# EasyEDA Pro project sataswitch.eprj

# Schematic Schematic1

## Sheets
1 ESP-12F: Board Name: Board1; Create Date: 2024-12-13; Page Name: ESP-12F; Project Name: sataswitch; Schematic Name: Schematic1; Update Date: 2024-12-13; Company: 嘉立创EDA; Page Size: A4; Version: V1.0
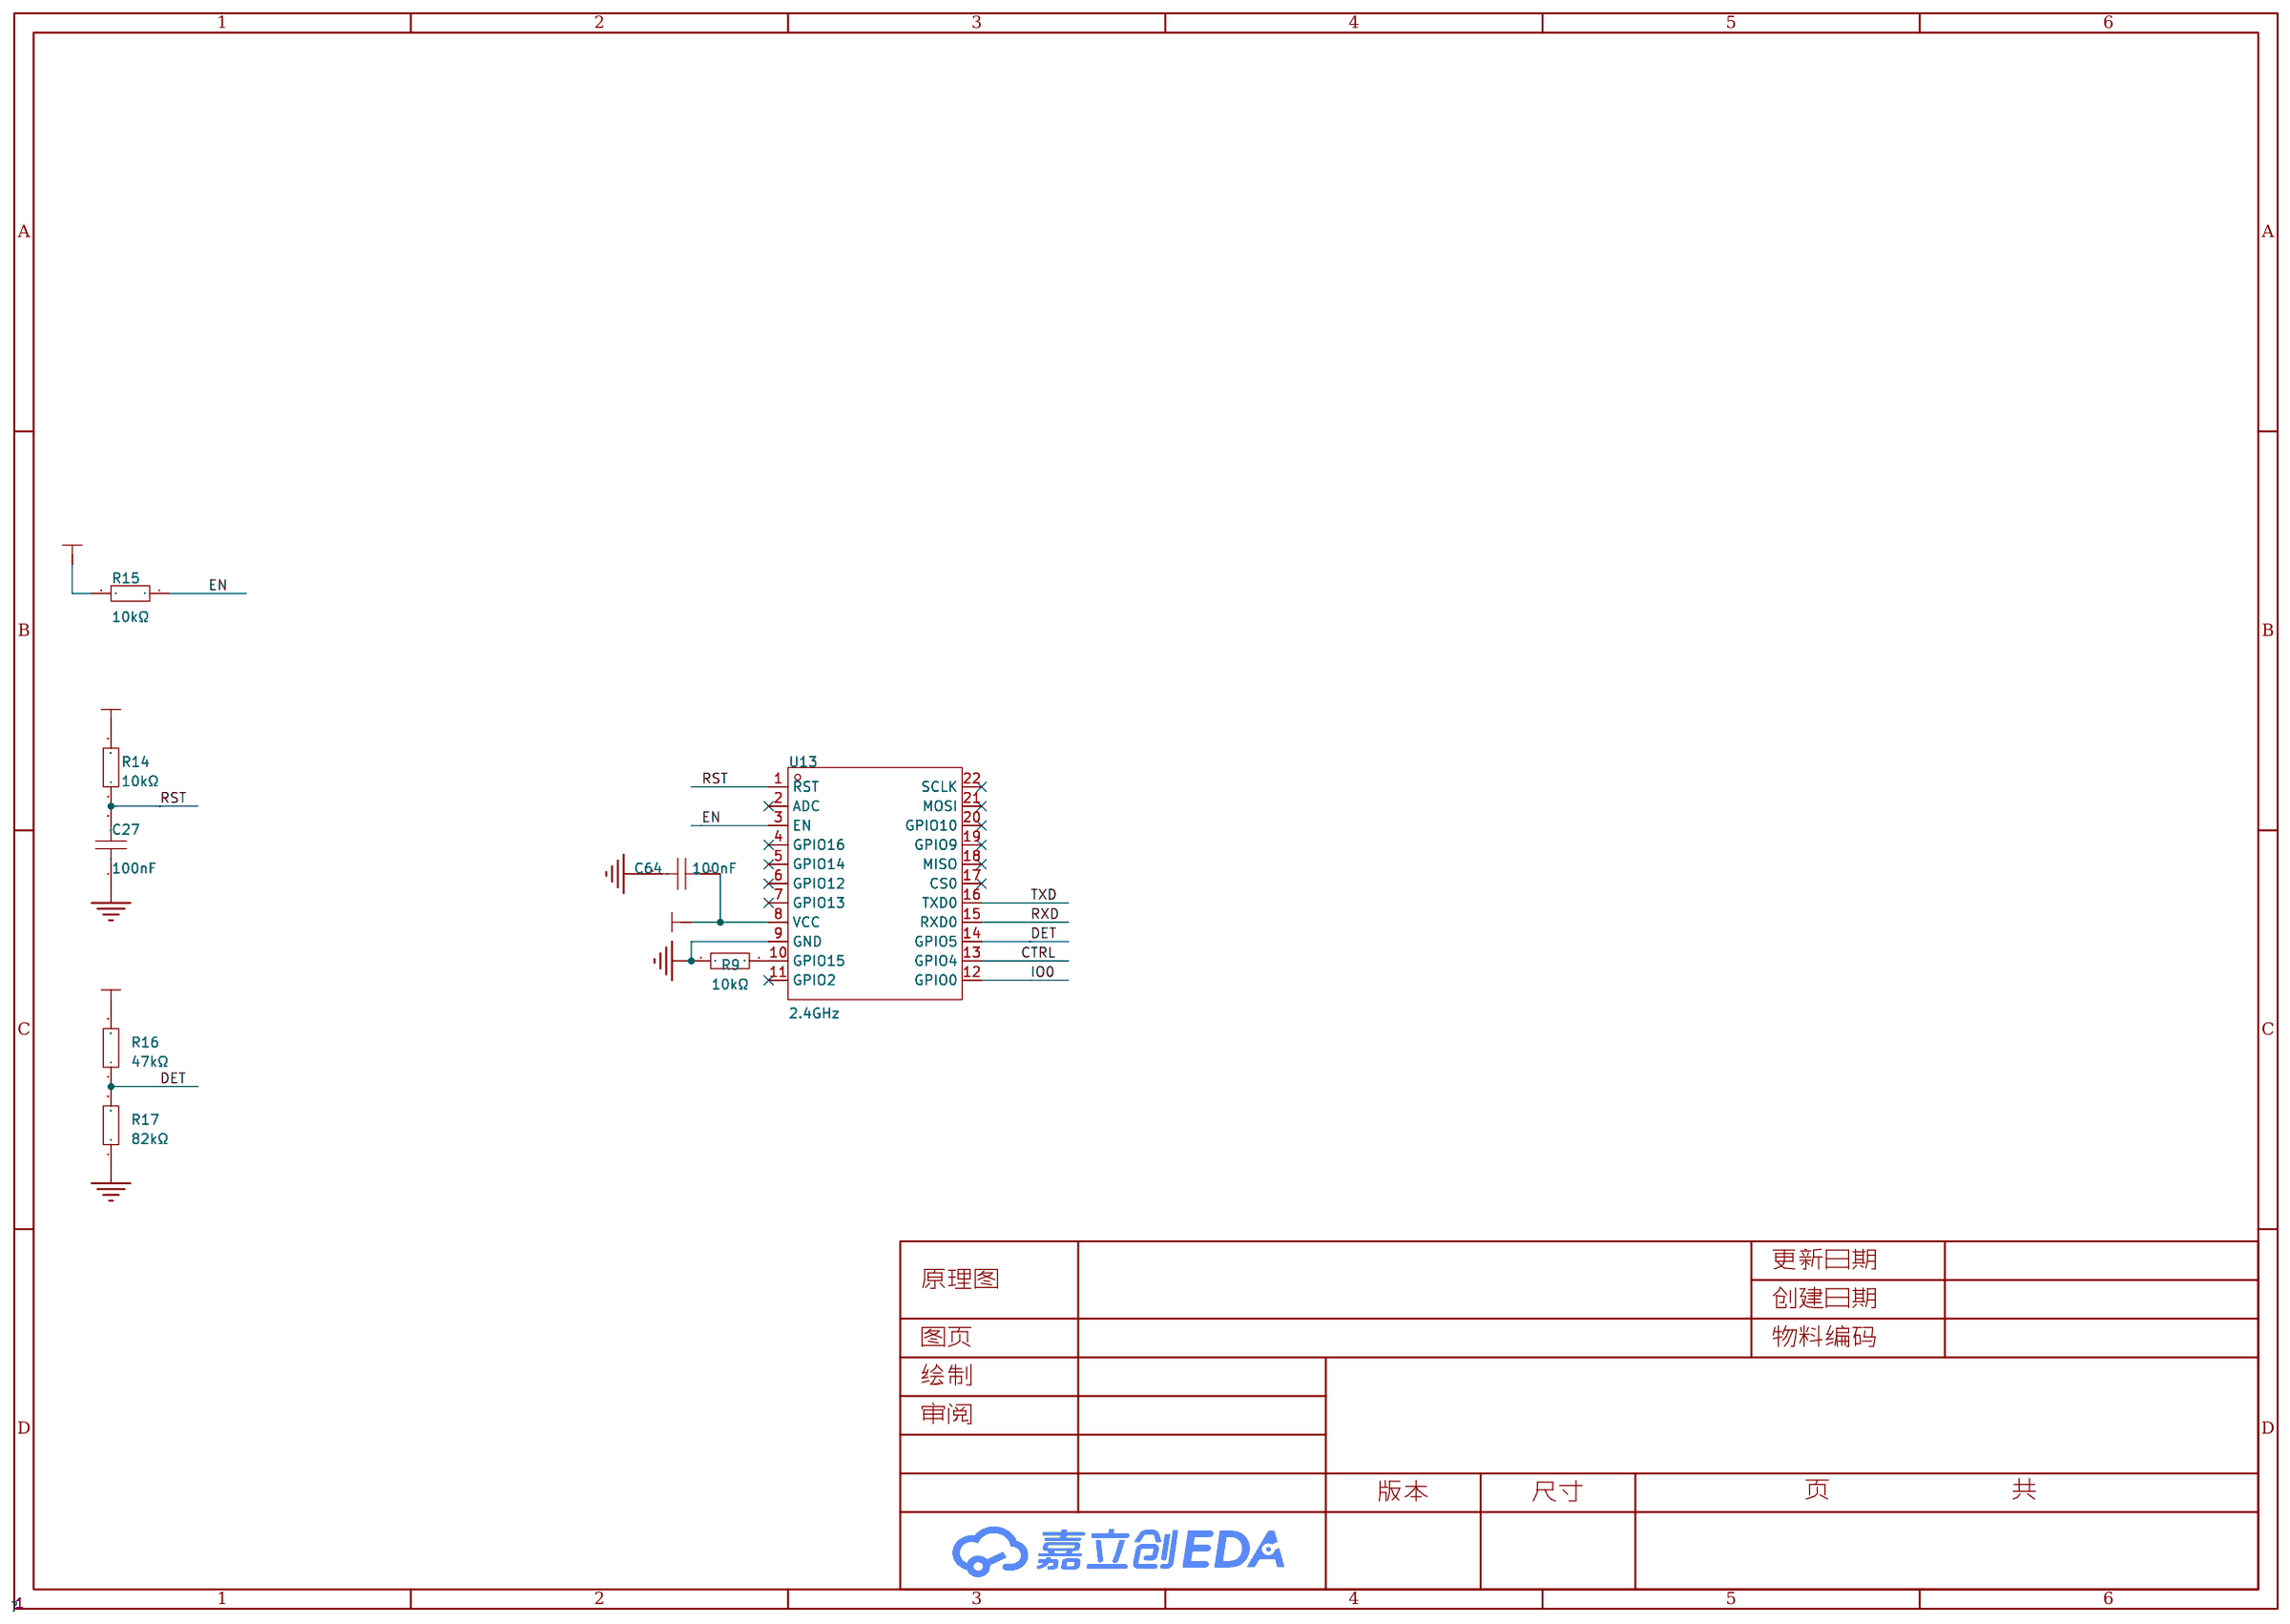
[diagram p0: ESP-12F]
2 CH340K自动下载: Page Name: CH340K自动下载
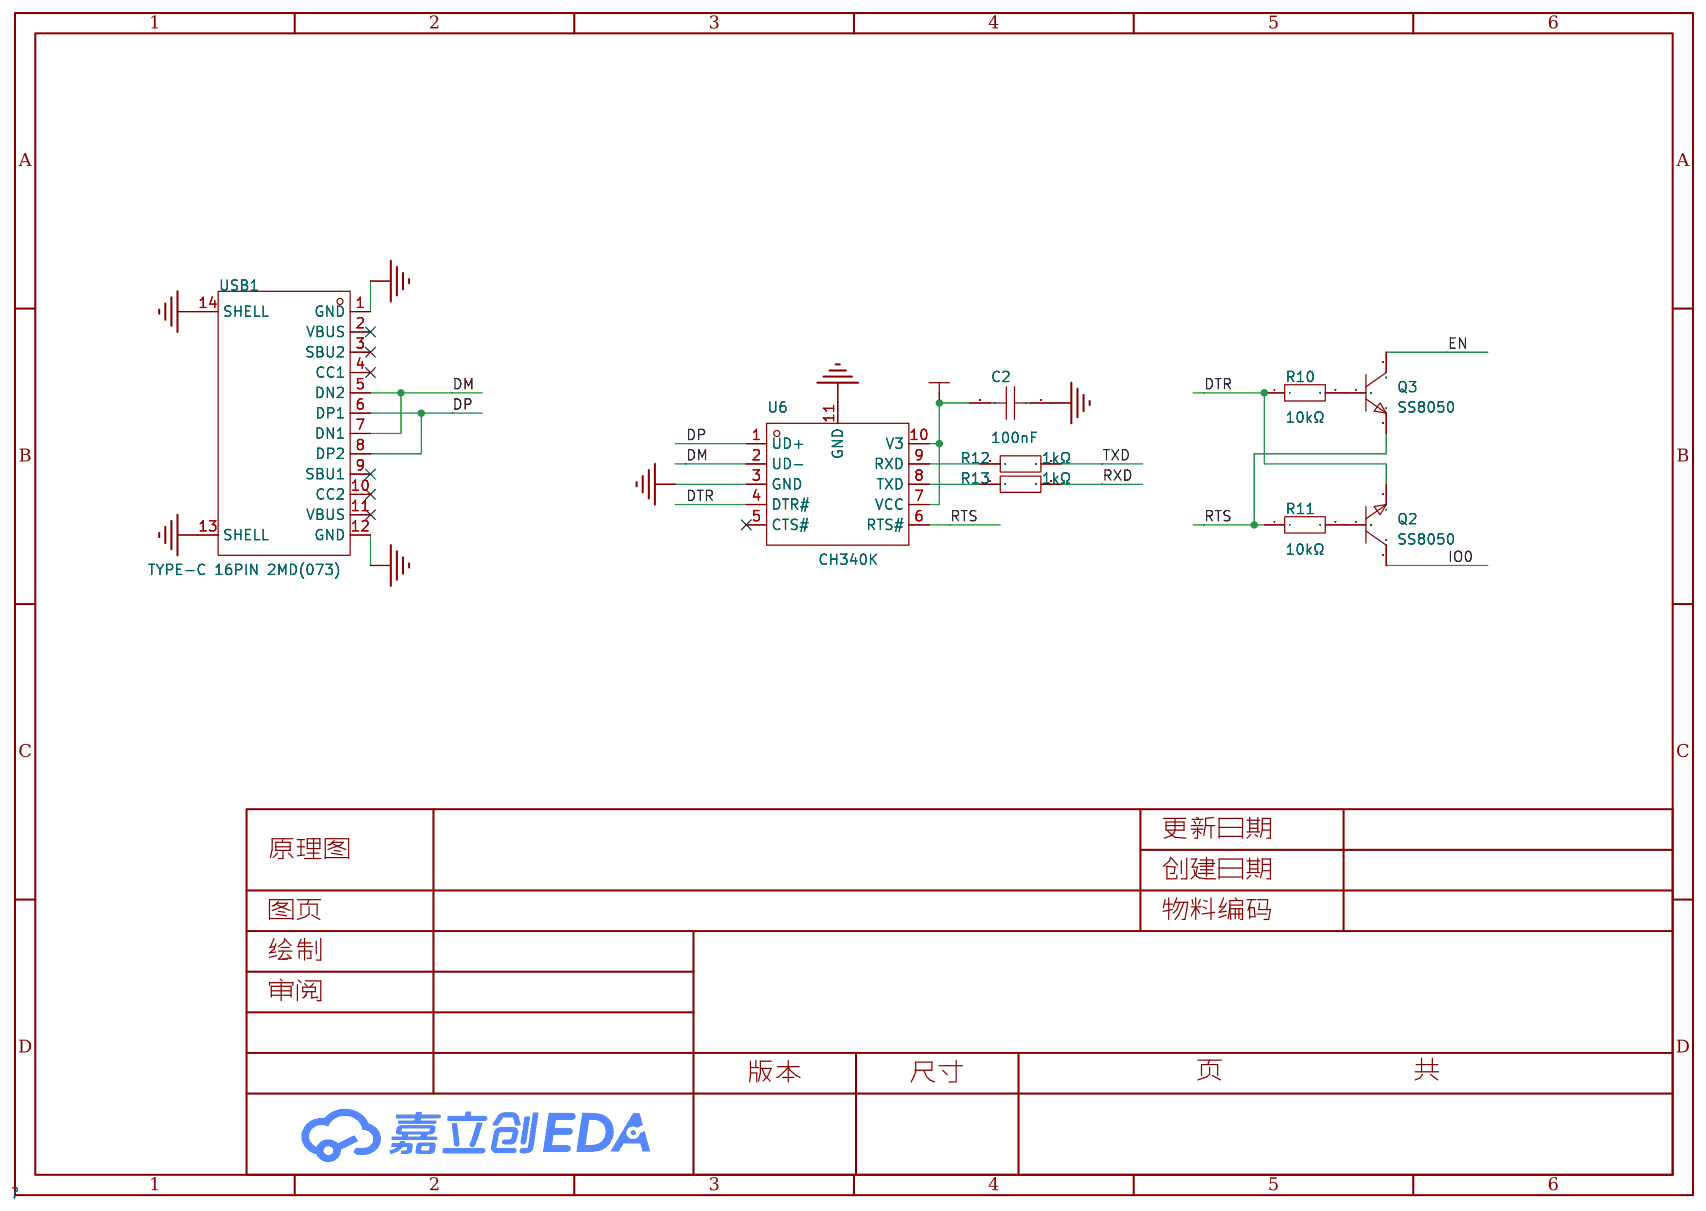
[diagram p1: CH340K自动下载]
3 POWER: Page Name: POWER
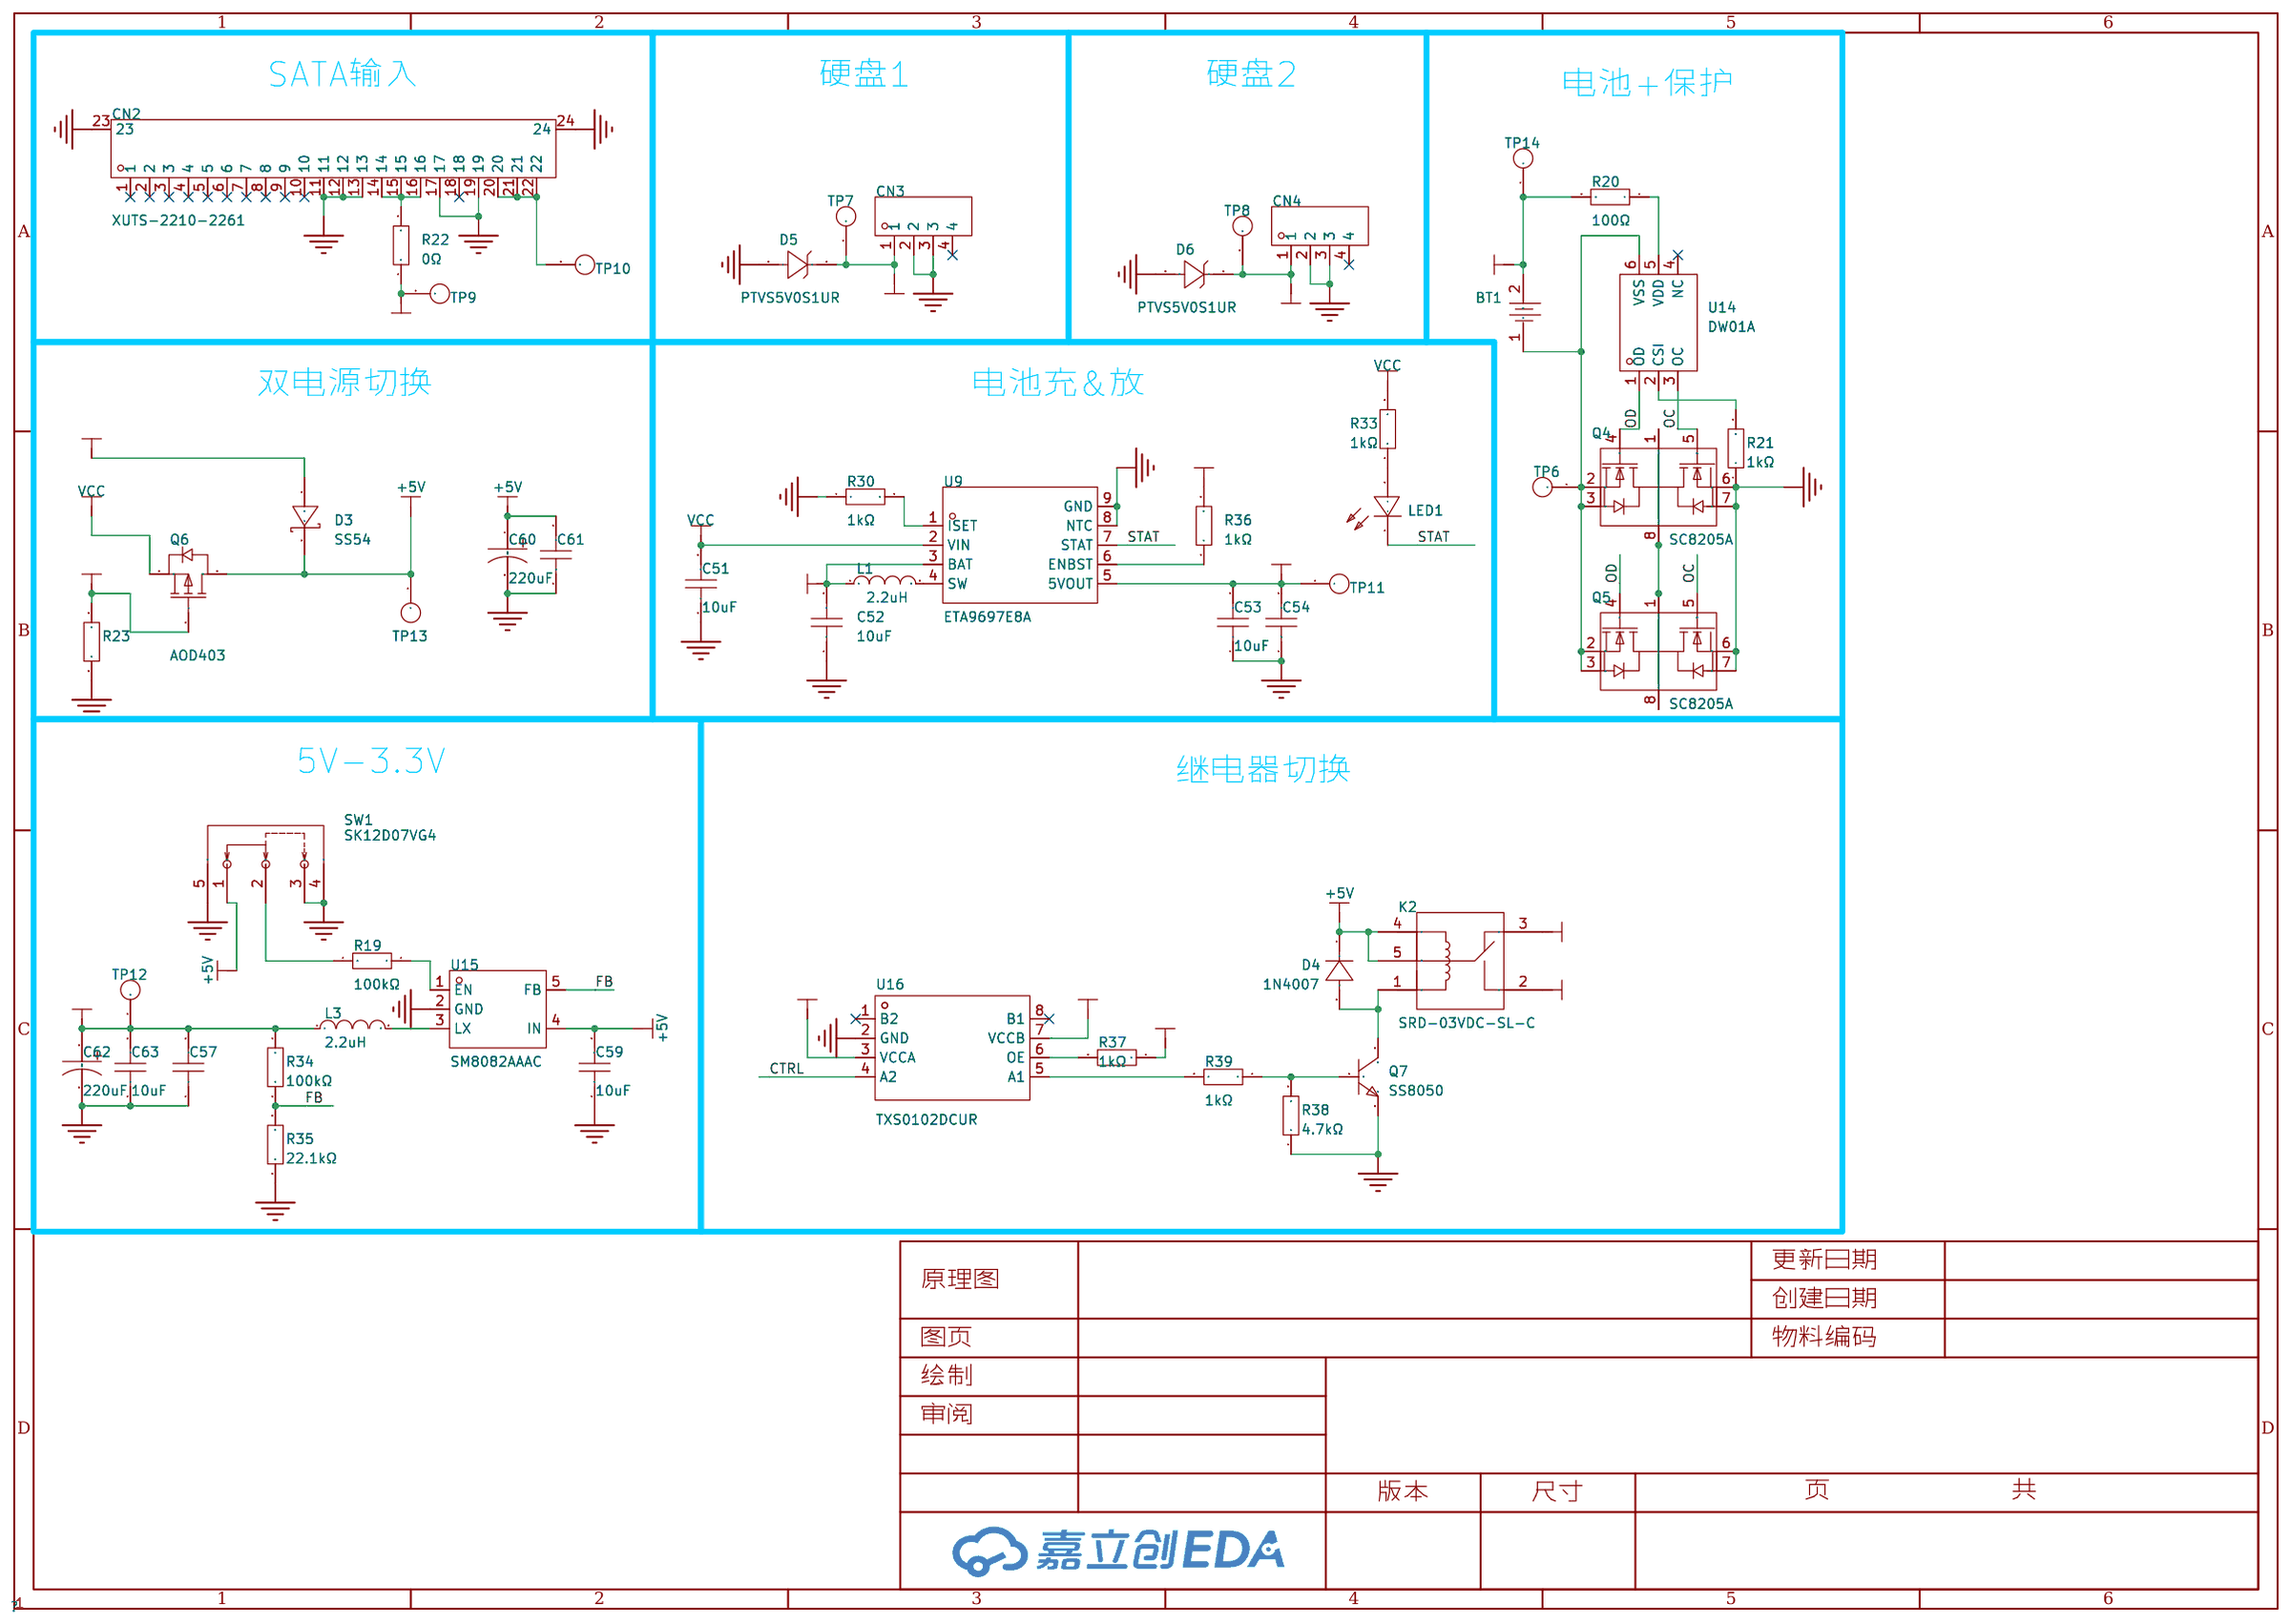
[diagram p2: POWER]

## Parts
sheet CH340K自动下载
C2  100nF  [C0603]
Q2  SS8050  [SOT-23-3_L2.9-W1.6-P1.90-LS2.8-BR]
Q3  SS8050  [SOT-23-3_L2.9-W1.6-P1.90-LS2.8-BR]
R10  10kΩ  [R0603]
R11  10kΩ  [R0603]
R12  1kΩ  [R0603]
R13  1kΩ  [R0603]
U6  CH340K  [ESOP-10_L4.9-W3.9-P1.00-LS6.0-BL-EP]
USB1  TYPE-C 16PIN 2MD(073)  [USB-C-SMD_TYPE-C-6PIN-2MD-073]
sheet ESP-12F
C27  100nF  [C0603]
C64  100nF  [C0603]
R9  10kΩ  [R0603]
R14  10kΩ  [R0603]
R15  10kΩ  [R0603]
R16  47kΩ  [R0603]
R17  82kΩ  [R0603]
U13  2.4GHz  [WIFIM-SMD_ESP-12F-ESP8266MOD]
sheet POWER
BT1  BH-18650-B1BA002  [BATTERY-SMD_18650-1S-L77.1-W20.7-1]
C51  10uF  [C0603]
C52  10uF  [C0603]
C53  10uF  [C0603]
C54  100nF  [C0603]
C57  100nF  [C0603]
C59  10uF  [C0603]
C60  220uF  [CAP-SMD_BD6.3-L6.6-W6.6-LS7.2-FD]
C61  100nF  [C0603]
C62  220uF  [CAP-SMD_BD6.3-L6.6-W6.6-LS7.2-FD]
C63  10uF  [C0603]
CN2  XUTS-2210-2261  [CONN-SMD_XUTS-2210-2261]
CN3  WAFER-PH2.0-4PZZ  [CONN-TH_4P-P2.00_FWF20001-S04S22W5B]
CN4  WAFER-PH2.0-4PZZ  [CONN-TH_4P-P2.00_FWF20001-S04S22W5B]
D3  SS54  [SMA_L4.4-W2.8-LS5.4-R-RD]
D4  1N4007  [SMA_L4.3-W2.5-LS5.0-RD]
D5  PTVS5V0S1UR  [SOD-123FL_L2.7-W1.8-LS3.8-RD]
D6  PTVS5V0S1UR  [SOD-123FL_L2.7-W1.8-LS3.8-RD]
K2  SRD-03VDC-SL-C  [RELAY-TH_SRD-03VDC-SL-C]
L1  2.2uH  [IND-SMD_L4.6-W4.1]
L3  2.2uH  [IND-SMD_L3.0-W3.0]
LED1  MHT192UGCT  [LED0603-RD_GREEN]
Q4  SC8205A  [TSSOP-8_L4.4-W3.0-P0.65-LS6.4-BL]
Q5  SC8205A  [TSSOP-8_L4.4-W3.0-P0.65-LS6.4-BL]
Q6  AOD403  [TO-252-3_L6.5-W5.8-P4.58-TL]
Q7  SS8050  [SOT-23-3_L2.9-W1.6-P1.90-LS2.8-BR]
R19  100kΩ  [R0603]
R20  100Ω  [R0603]
R21  1kΩ  [R0603]
R22  0Ω  [R2512]
R23  10kΩ  [R0603]
R30  1kΩ  [R0603]
R33  1kΩ  [R0603]
R34  100kΩ  [R0603]
R35  22.1kΩ  [R0603]
R36  1kΩ  [R0603]
R37  1kΩ  [R0603]
R38  4.7kΩ  [R0603]
R39  1kΩ  [R0603]
SW1  SK12D07VG4  [SW-TH_SK12D07VG4]
TP6  -  [测试点]
TP7  -  [测试点]
TP8  -  [测试点]
TP9  -  [测试点]
TP10  -  [测试点]
TP11  -  [测试点]
TP12  -  [测试点]
TP13  -  [测试点]
TP14  -  [测试点]
U9  ETA9697E8A  [ESOP-8_L4.9-W3.9-P1.27-LS6.0-BL-EP]
U14  DW01A  [SOT-23-6_L2.9-W1.6-P0.95-LS2.8-BL]
U15  SM8082AAAC  [SOT-23-5_L3.0-W1.7-P0.95-LS2.8-BL]
U16  TXS0102DCUR  [VSON8_L2.0-W2.3-P0.50-LS3.1-BL]

## Library data of the parts
C2 C27 C54 C57 C61 C64 = CC0603KRX7R9BB104: 容值:100nF;精度:±10%;额定电压:50V;材质(温度系数):X7R;; LCSC Part Name: 100nF ±10% 50V; Supplier Part: C14663; Manufacturer: YAGEO(国巨); Supplier Footprint: 0603; JLCPCB Part Class: 基础库; Datasheet: https://atta.szlcsc.com/upload/public/pdf/source/20180910/C282072_33301C7F631E79921B82A8DAC6BCC5B3.pdf; Supplier: LCSC; Tolerance: ±10%; Voltage Rated: 50V; Temperature Coefficient: X7R
Q2 Q3 Q7 = SS8050_C181160: 晶体管类型:NPN;集电极电流(Ic):1.5A;集射极击穿电压(Vceo):25V;功率(Pd):300mW;直流电流增益(hFE@Ic,Vce):200@100mA,1V;; LCSC Part Name: NPN 电流:1.5A 耐压:25V H档（200-350）; Supplier Part: C181160; Manufacturer: Hottech(合科泰); Supplier Footprint: SOT-23; JLCPCB Part Class: 扩展库; Datasheet: https://atta.szlcsc.com/upload/public/pdf/source/20220506/87BBA77FEE9CB4B19031AE933C67329E.pdf; Supplier: LCSC; Transistor Type: NPN; Collector Current (Ic): 1.5A; Collector-Emitter Breakdown Voltage (Vceo): 25V; Power Dissipation (Pd): 300mW; DC Current Gain (hFE@Ic,Vce): 200@100mA,1V; Transition Frequency (fT): 100MHz; Collector Cut-Off Current (Icbo): 100nA; Collector-Emitter Saturation Voltage (VCE(sat)@Ic,Ib): 500mV@800mA,80mA
R9-R11 R14 R15 R23 = 0603WAF1002T5E: 电阻类型:厚膜电阻;阻值:10kΩ;精度:±1%;功率:100mW;最大工作电压:75V;温度系数:±100ppm/℃;; LCSC Part Name: 厚膜电阻 10kΩ ±1% 100mW; Supplier Part: C25804; Manufacturer: UNI-ROYAL(厚声); Supplier Footprint: 0603; JLCPCB Part Class: 基础库; Datasheet: https://atta.szlcsc.com/upload/public/pdf/source/20200306/C422600_1E6D84923E4A46A82E41ADD87F860B5C.pdf; Supplier: LCSC; Type: 厚膜电阻; Tolerance: ±1%; Power(Watts): 100mW; Overload Voltage (Max): 75V; Temperature Coefficient: ±100ppm/℃; Operating Temperature Range: -55℃~+155℃
R12 R13 R21 R30 R33 R36 R37 R39 = 0603WAF1001T5E: 电阻类型:厚膜电阻;阻值:1kΩ;精度:±1%;功率:100mW;最大工作电压:75V;温度系数:±100ppm/℃;; LCSC Part Name: 1kΩ ±1% 100mW 厚膜电阻; Supplier Part: C21190; Manufacturer: UNI-ROYAL(厚声); Supplier Footprint: 0603; JLCPCB Part Class: 基础库; Datasheet: https://atta.szlcsc.com/upload/public/pdf/source/20200306/C422600_1E6D84923E4A46A82E41ADD87F860B5C.pdf; Supplier: LCSC; Type: 厚膜电阻; Tolerance: ±1%; Power(Watts): 100mW; Overload Voltage (Max): 75V; Temperature Coefficient: ±100ppm/℃; Operating Temperature Range: -55℃~+155℃
U6 = CH340K_C18208922: LCSC Part Name: CH340K 人工转编带; Supplier Part: C18208922; Manufacturer: WCH(南京沁恒); Supplier Footprint: ESSOP-10-150mil-1mm; JLCPCB Part Class: 扩展库; Datasheet: https://atta.szlcsc.com/upload/public/pdf/source/20240313/9D833A30DDFD16C064A7ADE10A944019.pdf; Supplier: LCSC
USB1 = TYPE-C 16PIN 2MD(073): LCSC Part Name: Type-C 母 卧贴; Supplier Part: C2765186; Manufacturer: SHOU HAN(首韩); Supplier Footprint: SMD; JLCPCB Part Class: 扩展库; Datasheet: https://atta.szlcsc.com/upload/public/pdf/source/20211123/39B17C16241EAC15C5E277BDA434118E.pdf; Supplier: LCSC; Connector Type: Type-C; Standard: USB 3.1; Gender: 母; Mounting Style: 卧贴; Number of Contacts: 16P; Number of Ports: 1; Current Rating - Power (Max): 5A; Operating Temperature Range: -25℃~+85℃; Rated Voltage (Max): 5V; Connect-Disconnect Life: 5千次; Core Colour: 黑色
R16 = 0603WAF4702T5E: LCSC Part Name: 47kΩ ±1% 100mW 厚膜电阻; Supplier Part: C25819; Manufacturer: UNI-ROYAL(厚声); Supplier Footprint: 0603; JLCPCB Part Class: 基础库; Datasheet: https://atta.szlcsc.com/upload/public/pdf/source/20200306/C422600_1E6D84923E4A46A82E41ADD87F860B5C.pdf; Supplier: LCSC; Type: 厚膜电阻; Tolerance: ±1%; Power(Watts): 100mW; Overload Voltage (Max): 75V; Temperature Coefficient: ±100ppm/℃; Operating Temperature Range: -55℃~+155℃
R17 = 0603WAF8202T5E: LCSC Part Name: 82kΩ ±1% 100mW 厚膜电阻; Supplier Part: C23254; Manufacturer: UNI-ROYAL(厚声); Supplier Footprint: 0603; JLCPCB Part Class: 基础库; Datasheet: https://atta.szlcsc.com/upload/public/pdf/source/20200306/C422600_1E6D84923E4A46A82E41ADD87F860B5C.pdf; Supplier: LCSC; Type: 厚膜电阻; Tolerance: ±1%; Power(Watts): 100mW; Overload Voltage (Max): 75V; Temperature Coefficient: ±100ppm/℃; Operating Temperature Range: -55℃~+155℃
U13 = ESP-12F(ESP8266MOD): 核心处理器:ESP8266芯片;频率:2.4GHz;天线形式:板载PCB天线;发射功率:16dBm;接收灵敏度:-90dBm;; LCSC Part Name: 完整的802.11b/g/nWi-FiSoC模块; Supplier Part: C82891; Manufacturer: Ai-Thinker(安信可); Supplier Footprint: SMD,16x24mm; JLCPCB Part Class: 扩展库; Datasheet: https://atta.szlcsc.com/upload/public/pdf/source/20210219/C82891_ABD84A460F4F056A2757267CCCA4B508.pdf; Supplier: LCSC; Core Processor: ESP8266芯片; Support Interface: GPIO；UART；I2C；PWM；SPI；ADC; Antenna Type: 板载PCB天线; Output Power: 16dBm; Operating Voltage: 3.3V; Receive  Current: 120mA; Send  Current: 170mA; Sensitivity: -90dBm; Operating Temperature: -40℃~+85℃
BT1 = BH-18650-B1BA002: LCSC Part Name: 电池盒 适用电池:18650; Supplier Part: C2988620; Manufacturer: MYOUNG(美阳); Supplier Footprint: SMD; JLCPCB Part Class: 扩展库; Datasheet: https://atta.szlcsc.com/upload/public/pdf/source/20220402/870DB99AB50CA0DF8D51CF7C86A51FAB.pdf; Supplier: LCSC; Connector Type: 电池盒; Battery Type: 18650
C51-C53 C59 C63 = CL10A106MA8NRNC: 容值:10uF;精度:±20%;额定电压:25V;材质(温度系数):X5R;; LCSC Part Name: 10uF ±20% 25V; Supplier Part: C96446; Manufacturer: SAMSUNG(三星); Supplier Footprint: 0603; JLCPCB Part Class: 基础库; Datasheet: https://atta.szlcsc.com/upload/public/pdf/source/20170325/1490427913016.pdf; Supplier: LCSC; Tolerance: ±20%; Voltage Rated: 25V; Temperature Coefficient: X5R
C60 C62 = RVT1C221M0605: LCSC Part Name: 220uF ±20% 16V; Supplier Part: C2977551; Manufacturer: ROQANG(容强); Supplier Footprint: SMD,D6.3xL5.4mm; JLCPCB Part Class: 扩展库; Datasheet: https://atta.szlcsc.com/upload/public/pdf/source/20220223/DD822675CC1DF2F0C06D5C2255C9C2D9.pdf; Supplier: LCSC; Tolerance: ±20%; Rated Voltage: 16V; Ripple Current: 95mA@122Hz; φD: 6.3mm; L: 5.4mm; Lifetime @ Temp: 2000hrs@105℃; Operating Temperature: -40℃~+105℃
CN2 = XUTS-2210-2261: Supplier Part: C18202153; Manufacturer: LX(连欣科技); Supplier Footprint: SMD,P=1.27mm,卧贴; JLCPCB Part Class: 扩展库; Datasheet: https://atta.szlcsc.com/upload/public/pdf/source/20230927/1661F2E424AC2027F10DB7F15241AB52.pdf; Supplier: LCSC
CN3 CN4 = WAFER-PH2.0-4PZZ: LCSC Part Name: PH 2.0mm 1x4P 直插; Supplier Part: C5359601; Manufacturer: XUNPU(讯普); Supplier Footprint: 插件,P=2mm; JLCPCB Part Class: 扩展库; Supplier: LCSC; Pins Structure: 1x4P; Pitch: 2mm; Mounting Style: 直插; Reference Series: PH; Number of Pins: 4P; Number of Rows: 1; Number of PINs Per Row: 4; Current Rating (Max): 2A; Operating Temperature Range: -25℃~+85℃
D3 = SS54_C22452: LCSC Part Name: 电压:40V 电流:5A; Supplier Part: C22452; Manufacturer: MDD(辰达半导体); Supplier Footprint: SMA(DO-214AC); JLCPCB Part Class: 基础库; Datasheet: https://atta.szlcsc.com/upload/public/pdf/source/20240710/73DFBB65C1883B895E62D589679033DF.pdf; Supplier: LCSC; Diode Configuration: 独立式; Forward Voltage (Vf@If): 550mV@5A; Reverse Voltage (Vr): 40V; Rectified Current: 5A; Reverse Leakage Current (Ir): 1mA@40V
D4 = 1N4007_C727081: 二极管配置:独立式;正向压降(Vf):1.1V@1A;直流反向耐压(Vr):1kV;整流电流:1A;; LCSC Part Name: 电压:1kV 电流:1A; Supplier Part: C727081; Manufacturer: TWGMC(台湾迪嘉); Supplier Footprint: SMA(DO-214AC); JLCPCB Part Class: 扩展库; Datasheet: https://atta.szlcsc.com/upload/public/pdf/source/20200828/C727079_3A05254382567072883400655AE0ED46.pdf; Supplier: LCSC; Diode Configuration: 独立式; Forward Voltage (Vf@If): 1.1V@1A; Reverse Voltage (Vr): 1kV; Rectified Current: 1A; Reverse Leakage Current: 5uA
D5 D6 = PTVS5V0S1UR: Supplier Part: C5380694; Manufacturer: FUXINSEMI(富芯森美); Supplier Footprint: SOD-123; JLCPCB Part Class: 扩展库; Datasheet: https://atta.szlcsc.com/upload/public/pdf/source/20240115/1F327C98E07612BCEC3AECE7F1FF94CE.pdf; Supplier: LCSC; polarity: 单向; Reverse Stand-Off Voltage (Vrwm): 5V; Maximum Clamping Voltage: 9.2V; Peak Pulse Current (Ipp): 43.6A; Peak Pulse Power Dissipation (Ppp): 400W; Breakdown Voltage: 6.4V; Reverse Leakage Current (Ir): 500uA; Number of Lines: 单路; Type: TVS
K2 = SRD-03VDC-SL-C_C496430: 线圈电压:3V;触点形式:一组转换:1C(单刀双掷-转换);触点容量(电阻负载):-;最大切换电压:250V@AC;最大切换电流:15A;; LCSC Part Name: 3V继电器 单刀双掷 蓝色; Supplier Part: C496430; Manufacturer: 松乐; Supplier Footprint: 插件,15.6x19.2mm; JLCPCB Part Class: 扩展库; Datasheet: https://atta.szlcsc.com/upload/public/pdf/source/20211029/0AF1F09028F3938DCCE87F54F358E4BA.pdf; Supplier: LCSC; Coil Voltage: 3V; Contact Form: 一组转换:1C(单刀双掷-转换); Pin Number: 5; Maximum Switching Voltage: 250V@AC; Coil Rated Power: 360mW; Maximum Switching Current: 15A; Coil Type: 无极性-单线圈; Contact Resistance: 100mΩ; Operate Time: 10ms; Release Time: 10ms
L1 = BMRA000404202R2MA1: LCSC Part Name: 2.2uH ±20% 3A; Supplier Part: C2758344; Manufacturer: chilisin(奇力新); Supplier Footprint: SMD,4.1x4.6mm; JLCPCB Part Class: 扩展库; Datasheet: https://atta.szlcsc.com/upload/public/pdf/source/20201014/C882054_13A9FAE734A23C1BA894A547D6066DD3.pdf; Supplier: LCSC; Tolerance: ±20%; Rated Current: 3A; Saturation Current (Isat): 3A; DC Resistance (DCR): 58mΩ; Type: 屏蔽电感
L3 = SWPA3015S2R2NT: 电感值:2.2uH;精度:±30%;额定电流:1.6A;饱和电流(Isat):2A;类型:-;; LCSC Part Name: 2.2uH ±30% 2A; Supplier Part: C19734; Manufacturer: Sunlord(顺络); Supplier Footprint: SMD; JLCPCB Part Class: 扩展库; Datasheet: https://atta.szlcsc.com/upload/public/pdf/source/20231024/317626D2AA2F8AB4113C1875E432E6E1.pdf; Supplier: LCSC; Tolerance: ±30%; Rated Current: 1.6A; Saturation Current (Isat): 2A; DC Resistance (DCR): 78mΩ
LED1 = MHT192UGCT: 发光颜色:翠绿色;功率:60mW;正向电流:20mA;主波长:515nm~530nm;二极管配置:-;透镜颜色:无色透明透镜;色温:-;发光角度:120°;载带方式:-;工作温度:-40℃~+85℃;; LCSC Part Name: 翠绿; Supplier Part: C389519; Manufacturer: MEIHUA(美华); Supplier Footprint: 0603; JLCPCB Part Class: 扩展库; Datasheet: https://atta.szlcsc.com/upload/public/pdf/source/20190515/C389519_7BC27E831414348C8AF19AF18EE4BF58.pdf; Supplier: LCSC; Emitted Color: 翠绿色; Power Dissipation: 60mW; Forward Current: 20mA; Dominant Wavelength: 515nm~530nm; Peak Wavelength: 518nm; Lens Color: 无色透明透镜; Viewing Angle: 120°; Operating Temperature: -40℃~+85℃
Q4 Q5 = SC8205A: 类型:1个N沟道;漏源电压(Vdss):20V;连续漏极电流(Id):6A;功率(Pd):2W;导通电阻(RDS(on)@Vgs,Id):25mΩ@10V,5A;阈值电压(Vgs(th)@Id):1.5V@250uA;; LCSC Part Name: 1个N沟道 耐压:20V 电流:6A; Supplier Part: C83931; Manufacturer: FM(富满); Supplier Footprint: TSSOP-8; JLCPCB Part Class: 扩展库; Datasheet: https://atta.szlcsc.com/upload/public/pdf/source/20161024/1477288575793.pdf; Supplier: LCSC; Type: 1个N沟道; Drain Source Voltage (Vdss): 20V; Continuous Drain Current (Id): 6A; Power Dissipation (Pd): 2W; Drain Source On Resistance (RDS(on)@Vgs,Id): 25mΩ@10V,5A; Gate Threshold Voltage (Vgs(th)@Id): 1.5V@250uA
Q6 = AOD403: 类型:1个P沟道;漏源电压(Vdss):30V;连续漏极电流(Id):15A；70A;功率(Pd):2.5W；90W;导通电阻(RDS(on)@Vgs,Id):6mΩ@20V,20A;阈值电压(Vgs(th)@Id):3.5V@250uA;; LCSC Part Name: 1个P沟道 耐压:30V 电流:70A 电流:15A; Supplier Part: C28969; Manufacturer: AOS; Supplier Footprint: TO-252-2(DPAK); JLCPCB Part Class: 扩展库; Datasheet: https://atta.szlcsc.com/upload/public/pdf/source/20140324/1457707030467.pdf; Supplier: LCSC; Type: 1个P沟道; Drain Source Voltage (Vdss): 30V; Continuous Drain Current (Id): 15A；70A; Power Dissipation (Pd): 2.5W；90W; Drain Source On Resistance (RDS(on)@Vgs,Id): 6mΩ@20V,20A; Gate Threshold Voltage (Vgs(th)@Id): 3.5V@250uA; Total Gate Charge (Qg@Vgs): 120nC@10V; Input Capacitance (Ciss@Vds): 5.3nF@15V; Operating Temperature: -55℃~+175℃@(Tj)
R19 R34 = 0603WAJ0104T5E: 电阻类型:厚膜电阻;阻值:100kΩ;精度:±5%;功率:100mW;最大工作电压:75V;温度系数:±100ppm/℃;; LCSC Part Name: 100kΩ ±5% 100mW 厚膜电阻; Supplier Part: C15458; Manufacturer: UNI-ROYAL(厚声); Supplier Footprint: 0603; JLCPCB Part Class: 扩展库; Datasheet: https://atta.szlcsc.com/upload/public/pdf/source/20200306/C422600_1E6D84923E4A46A82E41ADD87F860B5C.pdf; Supplier: LCSC; Type: 厚膜电阻; Tolerance: ±5%; Power(Watts): 100mW; Overload Voltage (Max): 75V; Temperature Coefficient: ±100ppm/℃; Operating Temperature Range: -55℃~+155℃
R20 = 0603WAF1000T5E: 电阻类型:厚膜电阻;阻值:100Ω;精度:±1%;功率:100mW;最大工作电压:75V;温度系数:±200ppm/℃;; LCSC Part Name: 100Ω ±1% 100mW 厚膜电阻; Supplier Part: C22775; Manufacturer: UNI-ROYAL(厚声); Supplier Footprint: 0603; JLCPCB Part Class: 基础库; Datasheet: https://atta.szlcsc.com/upload/public/pdf/source/20200306/C422600_1E6D84923E4A46A82E41ADD87F860B5C.pdf; Supplier: LCSC; Type: 厚膜电阻; Tolerance: ±1%; Power(Watts): 100mW; Overload Voltage (Max): 75V; Temperature Coefficient: ±200ppm/℃; Operating Temperature Range: -55℃~+155℃
R22 = 25121WJ0000T4E: LCSC Part Name: 0Ω ±5% 1W 厚膜电阻; Supplier Part: C25469; Manufacturer: UNI-ROYAL(厚声); Supplier Footprint: 2512; JLCPCB Part Class: 扩展库; Datasheet: https://atta.szlcsc.com/upload/public/pdf/source/20200306/C422600_1E6D84923E4A46A82E41ADD87F860B5C.pdf; Supplier: LCSC; Type: 厚膜电阻; Tolerance: ±5%; Power(Watts): 1W; Overload Voltage (Max): 200V; Temperature Coefficient: ±800ppm/℃; Operating Temperature Range: -55℃~+155℃
R35 = 0603WAF2212T5E: 电阻类型:厚膜电阻;阻值:22.1kΩ;精度:±1%;功率:100mW;最大工作电压:75V;温度系数:±100ppm/℃;; LCSC Part Name: 22.1kΩ ±1% 100mW 厚膜电阻; Supplier Part: C25961; Manufacturer: UNI-ROYAL(厚声); Supplier Footprint: 0603; JLCPCB Part Class: 扩展库; Datasheet: https://atta.szlcsc.com/upload/public/pdf/source/20200306/C422600_1E6D84923E4A46A82E41ADD87F860B5C.pdf; Supplier: LCSC; Type: 厚膜电阻; Tolerance: ±1%; Power(Watts): 100mW; Overload Voltage (Max): 75V; Temperature Coefficient: ±100ppm/℃; Operating Temperature Range: -55℃~+155℃
R38 = 0603WAF4701T5E: 电阻类型:厚膜电阻;阻值:4.7kΩ;精度:±1%;功率:100mW;最大工作电压:75V;温度系数:±100ppm/℃;; LCSC Part Name: 4.7kΩ ±1% 100mW 厚膜电阻; Supplier Part: C23162; Manufacturer: UNI-ROYAL(厚声); Supplier Footprint: 0603; JLCPCB Part Class: 基础库; Datasheet: https://atta.szlcsc.com/upload/public/pdf/source/20200306/C422600_1E6D84923E4A46A82E41ADD87F860B5C.pdf; Supplier: LCSC; Type: 厚膜电阻; Tolerance: ±1%; Power(Watts): 100mW; Overload Voltage (Max): 75V; Temperature Coefficient: ±100ppm/℃; Operating Temperature Range: -55℃~+155℃
SW1 = SK12D07VG4: 电路结构:单刀双掷;安装方式:-;额定电流(DC):500mA;额定电压(DC):50V;额定电流(AC):-;额定电压(AC):-;机械寿命:5千次;; LCSC Part Name: 3脚2档位 卧插 滑动开关; Supplier Part: C393937; Manufacturer: SHOU HAN(首韩); Supplier Footprint: 插件; JLCPCB Part Class: 扩展库; Datasheet: https://atta.szlcsc.com/upload/public/pdf/source/20190521/C393937_939FE26E571CC67D2D532E953108A1B0.pdf; Supplier: LCSC; Circuit: 单刀双掷; Actuator Style: 矩形柱状; Pin Style: PC引脚; Switch Height: 8.8mm; Current Rating (DC): 500mA; Voltage Rating (DC): 50V; Mechanical Life: 5千次
TP6-TP14 = 测试点
U9 = ETA9697E8A_C7435201: Supplier Part: C7435201; Manufacturer: ETA(钰泰); Supplier Footprint: ESOP-8; JLCPCB Part Class: 扩展库; Datasheet: https://atta.szlcsc.com/upload/public/pdf/source/20230625/80AAA485CA54B35B01B370F494D596B3.pdf; Supplier: LCSC
U14 = DW01A: 电源电压:-300mV~8V;最大充电电流:-;电池类型:锂离子/聚合物;电池节数:1;; Supplier Part: C2927799; Manufacturer: YONGYUTAI(永裕泰); Supplier Footprint: SOT-23-6; JLCPCB Part Class: 扩展库; Datasheet: https://atta.szlcsc.com/upload/public/pdf/source/20211207/8DC9CB9A742765EFB66910D35511359F.pdf; Supplier: LCSC; The Chip Type: 电池保护芯片; Supply Voltage: -300mV~8V; Type of Battery: 锂离子/聚合物; Number of Cells: 1; Operating Temperature: -40℃~+85℃
U15 = SM8082AAAC: Supplier Part: C479068; Manufacturer: silergy(矽力杰); Supplier Footprint: SOT-23-5; JLCPCB Part Class: 扩展库; Datasheet: https://atta.szlcsc.com/upload/public/pdf/source/20200117/C479068_E57DEB93FA595E4CF9E29C7DD59EDE5A.pdf; Supplier: LCSC
U16 = TXS0102DCUR: LCSC Part Name: 24Mbps 2位双向电平转换器; Supplier Part: C53434; Manufacturer: TI(德州仪器); Supplier Footprint: VSSOP-8; JLCPCB Part Class: 扩展库; Datasheet: https://www.ti.com/cn/lit/gpn/txs0102; Supplier: LCSC; Channel Type: 双向; Data Rate: 24Mbps; Supply Voltage (VCCA): 1.65V~3.6V; Supply Voltage (VCCB): 2.3V~5.5V; Number of Circuits: 1; Channels per Circuit: 2; Output Type: 开路漏极；推挽式; Operating Temperature: -40℃~+85℃; Features: 自动方向检测

## Nets
3V3: C2.2 C57.2 C62.1 C63.2 C64.1 L3.1 R14.2 R15.2 R34.1 R37.1 TP12.1 U6.7(VCC) U6.10(V3) U13.8(VCC) U16.3(VCCA)
+5V: C59.2 C60.1 C61.2 D3.2(K) D4.1(K) K2.4 K2.5 Q6.2(D) SW1.1 TP13.1 U15.4(IN) U16.7(VCCB)
GND: C2.1 C27.1 C51.1 C52.1 C53.1 C54.1 C57.1 C59.1 C60.2 C61.1 C62.2 C63.1 C64.2 CN2.11 CN2.12 CN2.13 CN2.17 CN2.19 CN2.23 CN2.24 CN3.2 CN3.3 CN4.2 CN4.3 D5.2(A) D6.2(A) Q4.6(S2) Q4.7(S2) Q5.6(S2) Q5.7(S2) Q7.2(E) R9.1 R17.1 R21.1 R23.2 R30.1 R35.1 R38.1 SW1.3 SW1.4 SW1.5 U6.3(GND) U6.11(GND) U9.8(NTC) U9.9(GND) U13.9(GND) U15.2(GND) U16.2(GND) USB1.1(GND) USB1.12(GND) USB1.13(SHELL) USB1.14(SHELL)
VBAT: BT1.2 C52.2 L1.1 R20.2 R36.2 TP14.1 U9.3(BAT)
VCC: C51.2 Q6.3(S) R16.2 R22.1 R33.2 TP9.1 U9.2(VIN)
VCC_BK: C53.2 C54.2 D3.1(A) Q6.1(G) R23.1 TP11.1 U9.5(5VOUT)
CTRL: U13.13(GPIO4) U16.4(A2)
DET: R16.1 R17.2 U13.14(GPIO5)
DM: U6.2(UD-) USB1.5(DN2) USB1.7(DN1)
DP: U6.1(UD+) USB1.6(DP1) USB1.8(DP2)
DSK_1: CN3.1 D5.1(K) K2.2 TP7.1
DSK_2: CN4.1 D6.1(K) K2.3 TP8.1
DTR: Q2.2(E) R10.1 U6.4(DTR#)
EN: Q3.3(C) R15.1 U13.3(EN)
FB: R34.2 R35.2 U15.5(FB)
IO0: Q2.3(C) U13.12(GPIO0)
OC: Q4.5(G2) Q5.5(G2) U14.3(OC)
OD: Q4.4(G1) Q5.4(G1) U14.1(OD)
RST: C27.2 R14.1 U13.1(RST)
RTS: Q3.2(E) R11.1 U6.6(RTS#)
RXD: R13.2 U13.15(RXD0)
STAT: LED1.1(-) U9.7(STAT)
TXD: R12.2 U13.16(TXD0)
$2N350: R9.2 U13.10(GPIO15)
$3N377: Q3.1(B) R10.2
$3N444: Q2.1(B) R11.2
$3N643: R12.1 U6.9(RXD)
$3N646: R13.1 U6.8(TXD)
$4N468: CN2.14 CN2.15 CN2.16 R22.2
$4N1324: BT1.1 Q4.2(S1) Q4.3(S1) Q5.2(S1) Q5.3(S1) TP6.1 U14.6(VSS)
$4N1325: R20.1 U14.5(VDD)
$4N1333: R21.2 U14.2(CSI)
$4N1334: Q4.1(D12) Q4.8(D12) Q5.1(D12) Q5.8(D12)
$4N1454: CN2.20 CN2.21 CN2.22 TP10.1
$4N2608: R30.2 U9.1(ISET)
$4N2625: LED1.2(+) R33.1
$4N3320: R19.1 U15.1(EN)
$4N3323: L3.2 U15.3(LX)
$4N3333: R19.2 SW1.2
$4N3483: R36.1 U9.6(ENBST)
$4N3698: R37.2 U16.6(OE)
$4N3891: Q7.1(B) R38.2 R39.1
$4N3897: R39.2 U16.5(A1)
$4N4001: D4.2(A) K2.1 Q7.3(C)
$4N6210: L1.2 U9.4(SW)

Not connected (* = marked no-connect by the designer): CN2 1* 2* 3* 4* 5* 6* 7* 8* 9* 10* 18*; CN3 4*; CN4 4*; U6 5(CTS#)*; U13 2(ADC)* 4(GPIO16)* 5(GPIO14)* 6(GPIO12)* 7(GPIO13)* 11(GPIO2)* 17(CS0)* 18(MISO)* 19(GPIO9)* 20(GPIO10)* 21(MOSI)* 22(SCLK)*; U14 4(NC)*; U16 1(B2)* 8(B1)*; USB1 2(VBUS)* 3(SBU2)* 4(CC1)* 9(SBU1)* 10(CC2)* 11(VBUS)*

## Notes on the sheets
sheet 3
- SATA输入
- 硬盘1
- 硬盘2
- 电池+保护
- 双电源切换
- 电池充&放
- 5V-3.3V
- 继电器切换

# Board PCB1
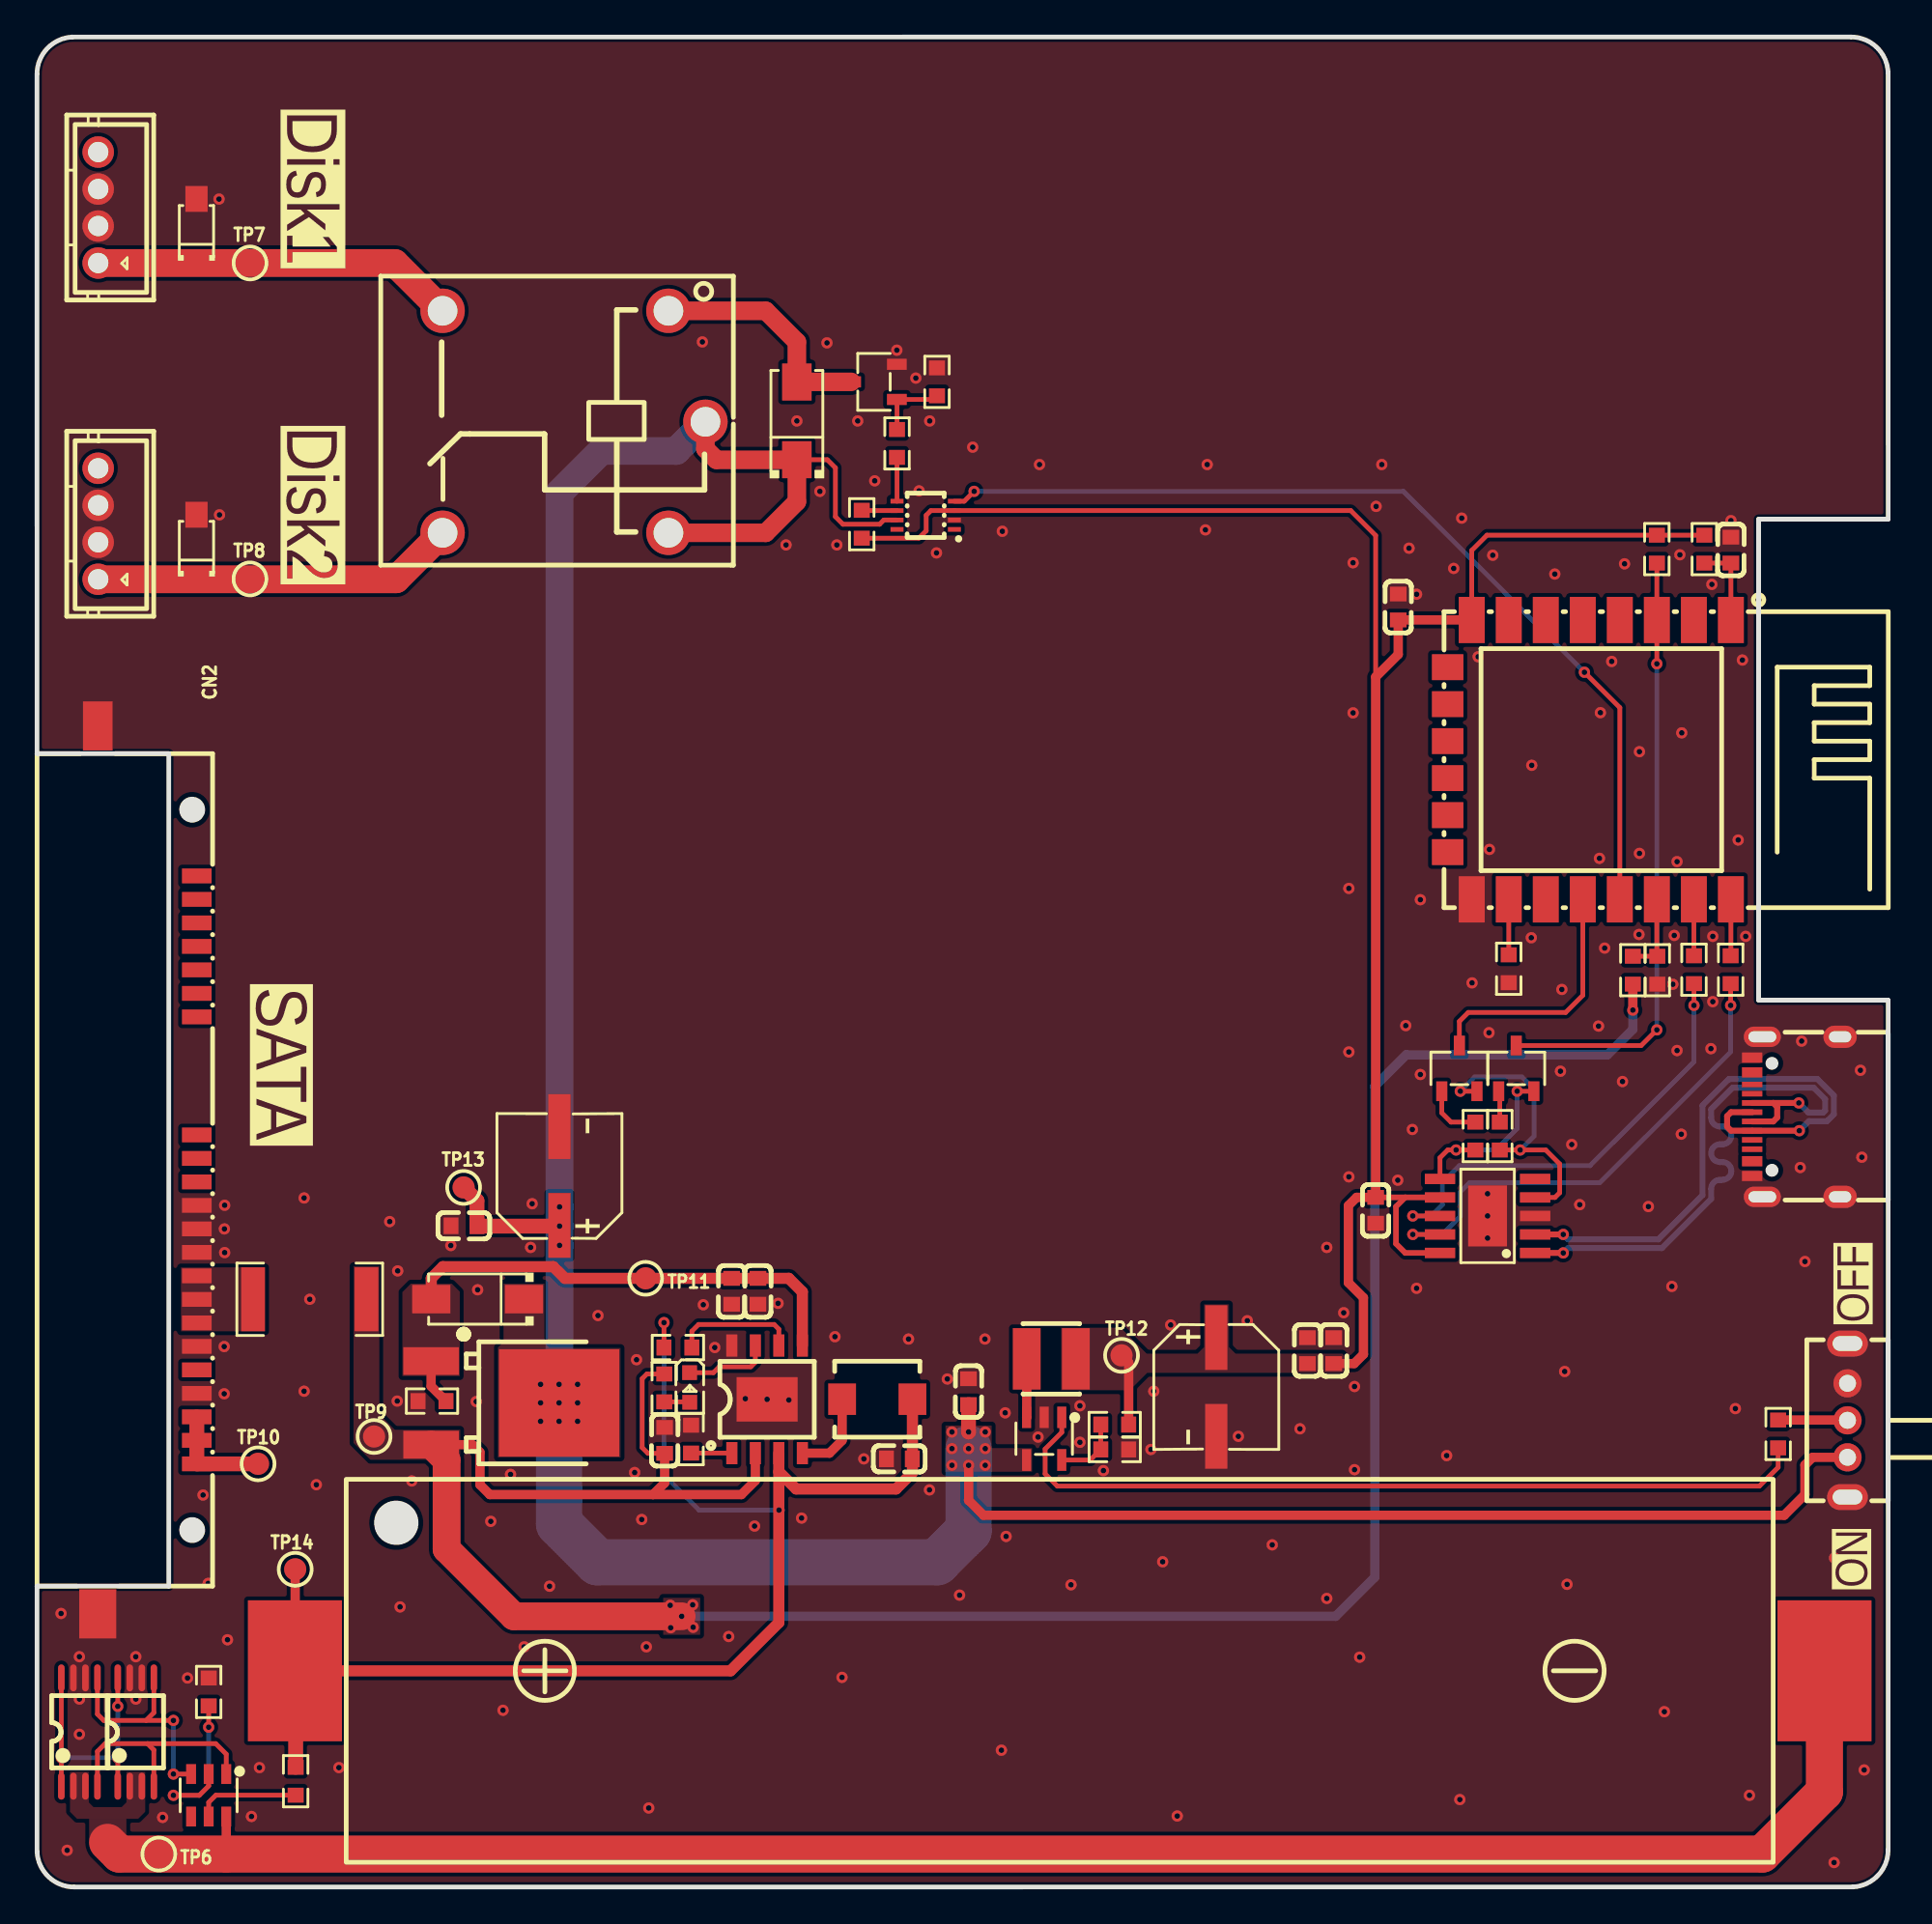
[diagram p3: board, top side]
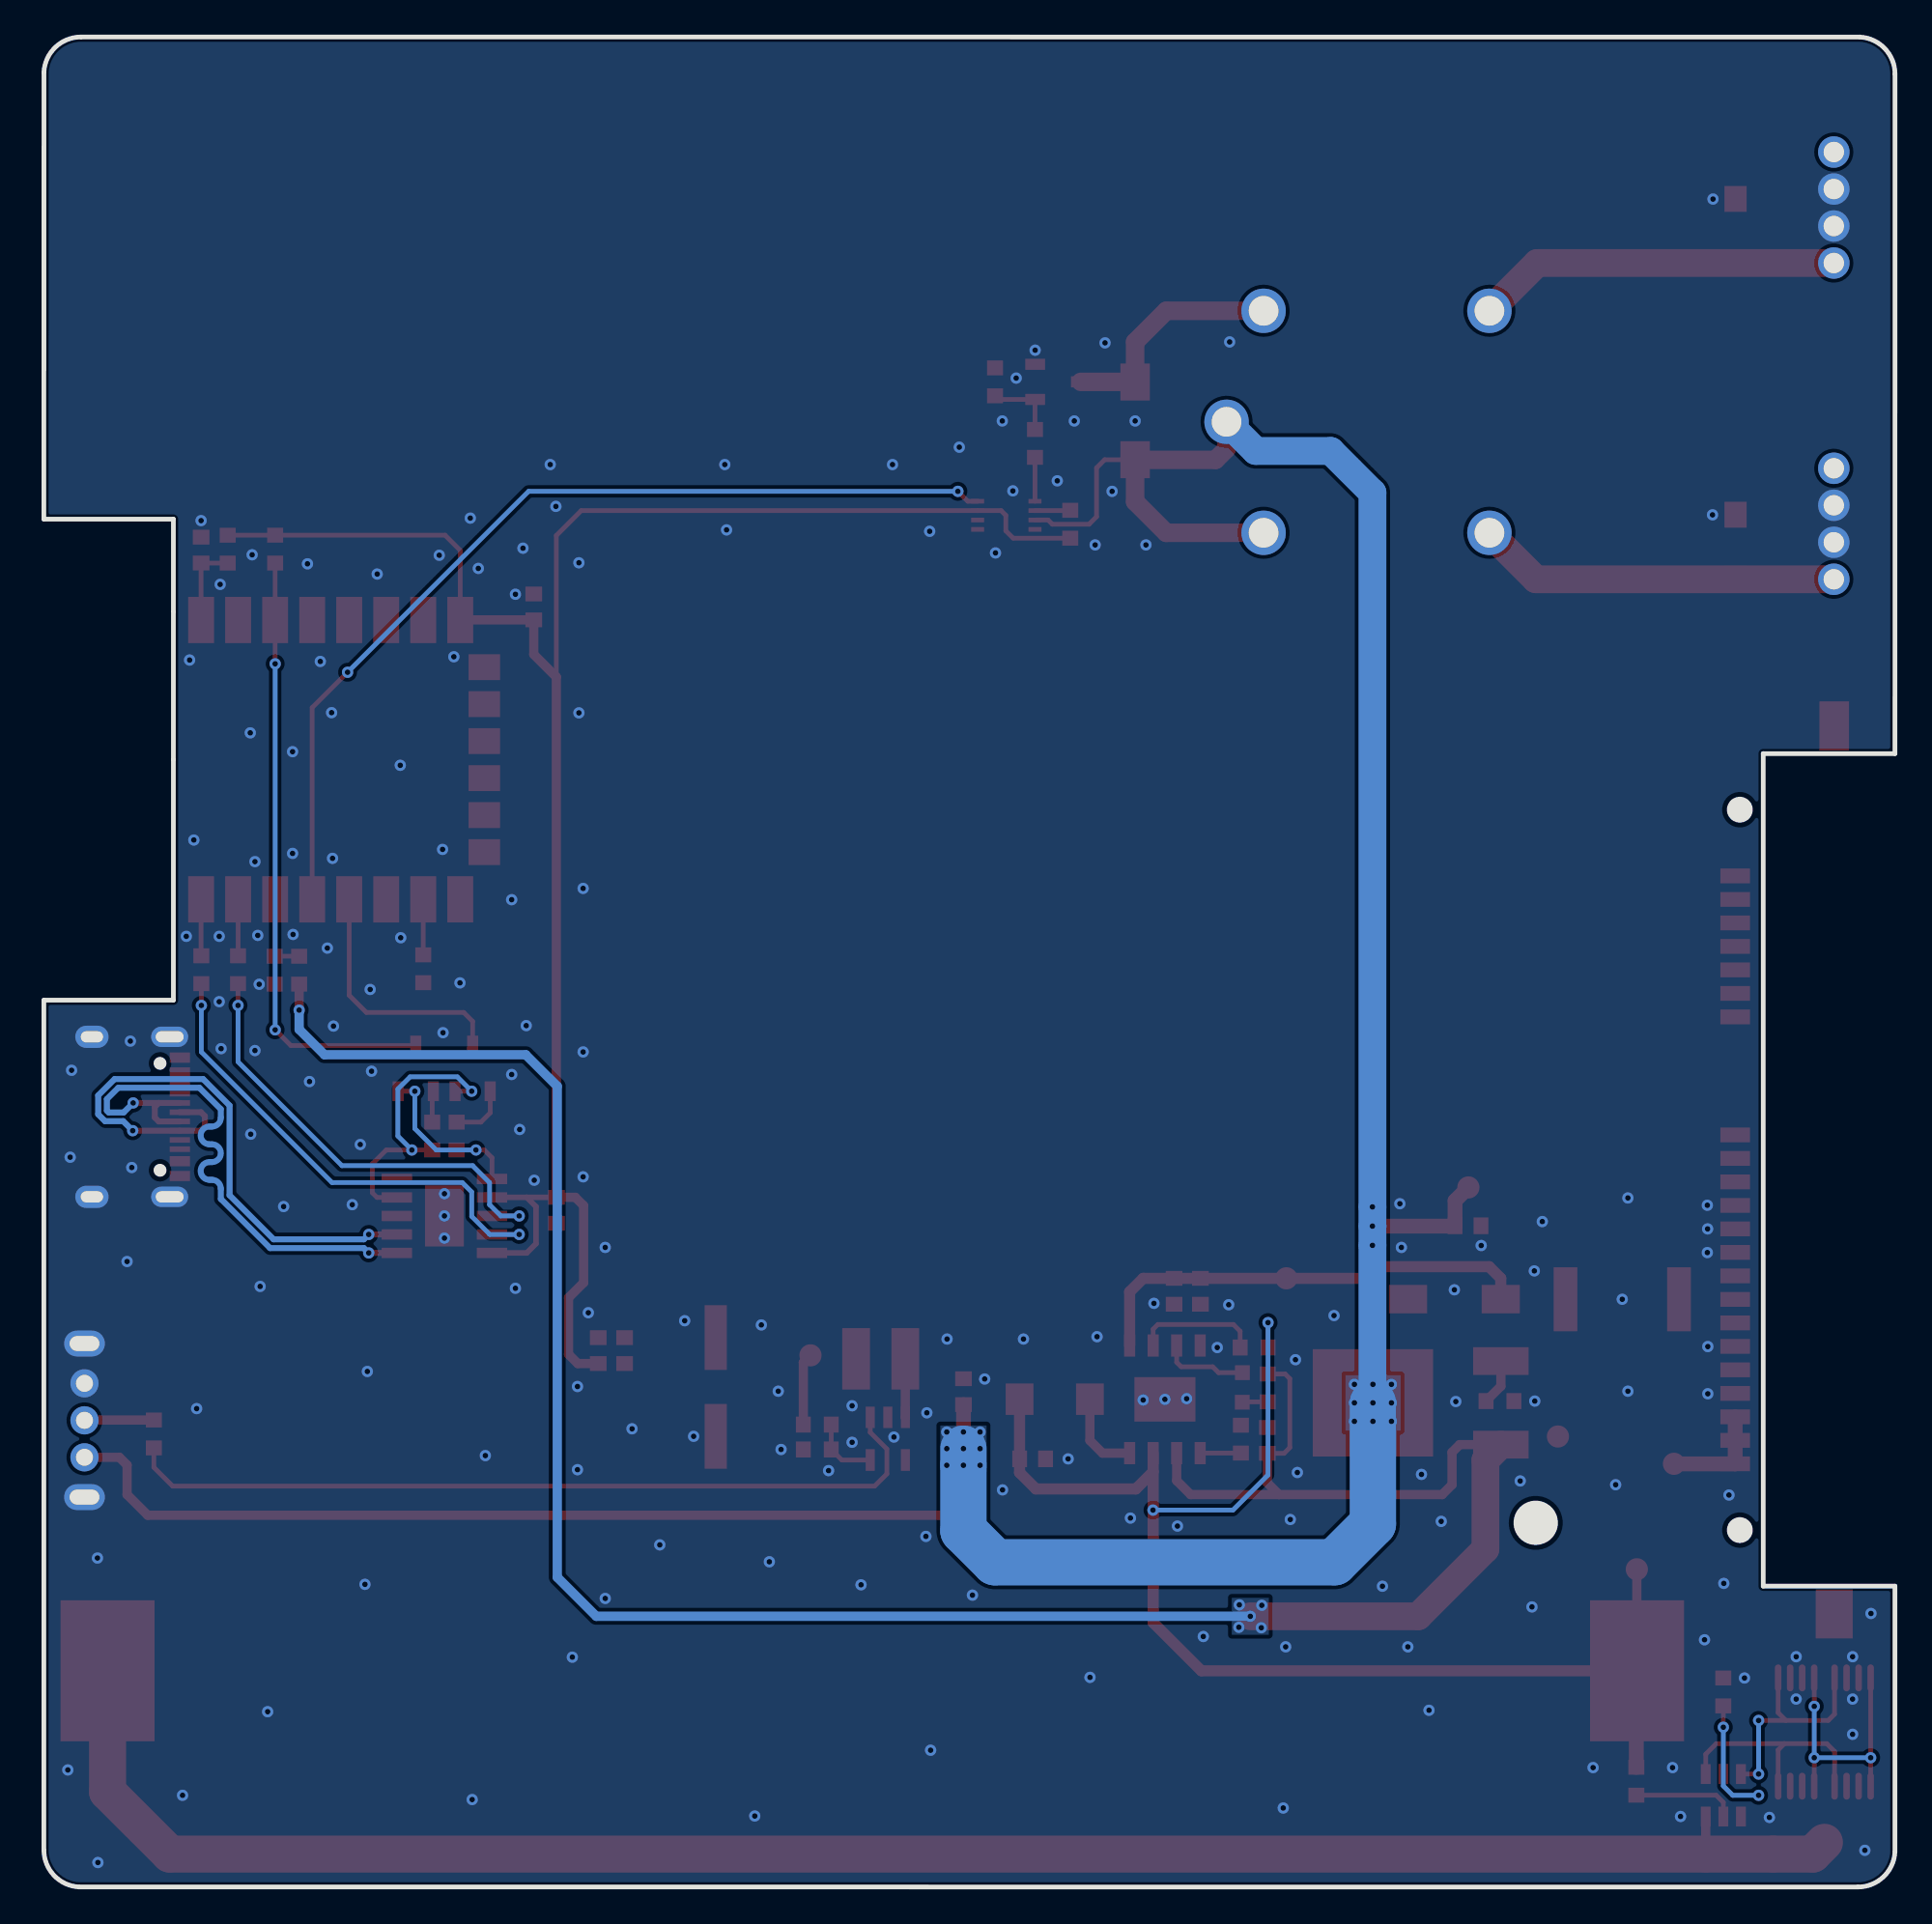
[diagram p4: board, bottom side, seen from below]

Outline 100 x 100 mm; copper layers: Top Layer, Bottom Layer. Coordinates in mm from the lower left corner of the outline.
Outline path: 0,61.26 0,98 arc(0.55,99.38) 1.9,100 98,100 arc(99.38,99.45) 100,98.1 100,73.94 93,73.94 93,47.94 100,47.94 100,2 arc(99.45,0.62) 98.1,0 2,0 arc(0.62,0.55) 0,1.9 0,16.26
Stack: Top Layer 0.035mm / Dielectric1 1.51mm FR4 er 4.5 / Bottom Layer 0.035mm

## Design rules (mm)
net DP: DP1
net DM: DP1
template: 自定义配置
spacing copperThickness1oz (default): track to track 0.102, other pairs 0.1 to 0.3
spacing copperThickness2oz: track to track 0.203, other pairs 0.152 to 0.3
track width copperThickness1oz (default): min 0.127, default 0.254, max 2.54
track width copperThickness2oz: min 0.203, default 0.254, max 2.54
differential pair differentialPair (default): width min 0.127, default 0.254, max 2.54; gap min 0.152, default 0.152
via viaSize (default): diameter min 0.5, default 0.61, max 10; hole min 0.3, default 0.305, max 6.3

## Placement (name value [footprint] x y rotation side)
BT1  BH-18650-B1BA002  [BATTERY-SMD_18650-1S-L77.1-W20.7-1]  55.25 11.69 90 top
C2  100nF  [C0603]  72.32 36.58 90 top
C27  100nF  [C0603]  91.51 72.27 270 top
C51  10uF  [C0603]  33.91 24.14 270 top
C52  10uF  [C0603]  46.59 23.14 0 top
C53  10uF  [C0603]  38.95 32.2 90 top
C54  100nF  [C0603]  37.52 32.2 90 top
C57  100nF  [C0603]  70.05 28.99 270 top
C59  10uF  [C0603]  50.32 26.77 270 top
C60  220uF  [CAP-SMD_BD6.3-L6.6-W6.6-LS7.2-FD]  28.22 38.43 90 top
C61  100nF  [C0603]  23.07 35.74 0 top
C62  220uF  [CAP-SMD_BD6.3-L6.6-W6.6-LS7.2-FD]  63.71 27.03 270 top
C63  10uF  [C0603]  68.63 28.99 270 top
C64  100nF  [C0603]  73.54 69.19 90 top
CN2  XUTS-2210-2261  [CONN-SMD_XUTS-2210-2261]  5.96 38.76 270 top
CN3  WAFER-PH2.0-4PZZ  [CONN-TH_4P-P2.00_FWF20001-S04S22W5B]  3.3 90.78 90 top
CN4  WAFER-PH2.0-4PZZ  [CONN-TH_4P-P2.00_FWF20001-S04S22W5B]  3.3 73.69 90 top
D3  SS54  [SMA_L4.4-W2.8-LS5.4-R-RD]  23.8 31.78 180 top
D4  1N4007  [SMA_L4.3-W2.5-LS5.0-RD]  41.05 79.25 90 top
D5  PTVS5V0S1UR  [SOD-123FL_L2.7-W1.8-LS3.8-RD]  8.61 89.51 90 top
D6  PTVS5V0S1UR  [SOD-123FL_L2.7-W1.8-LS3.8-RD]  8.61 72.44 90 top
K2  SRD-03VDC-SL-C  [RELAY-TH_SRD-03VDC-SL-C]  29.01 79.2 180 top
L1  2.2uH  [IND-SMD_L4.6-W4.1]  45.39 26.37 180 top
L3  2.2uH  [IND-SMD_L3.0-W3.0]  54.79 28.55 0 top
LED1  MHT192UGCT  [LED0603-RD_GREEN]  35.26 27 270 top
Q2  SS8050  [SOT-23-3_L2.9-W1.6-P1.90-LS2.8-BR]  76.84 44.25 270 top
Q3  SS8050  [SOT-23-3_L2.9-W1.6-P1.90-LS2.8-BR]  79.91 44.25 270 top
Q4  SC8205A  [TSSOP-8_L4.4-W3.0-P0.65-LS6.4-BL]  2.29 8.38 0 top
Q5  SC8205A  [TSSOP-8_L4.4-W3.0-P0.65-LS6.4-BL]  5.34 8.38 0 top
Q6  AOD403  [TO-252-3_L6.5-W5.8-P4.58-TL]  24.75 26.17 0 top
Q7  SS8050  [SOT-23-3_L2.9-W1.6-P1.90-LS2.8-BR]  45.21 81.36 0 top
R9  10kΩ  [R0603]  79.5 49.63 90 top
R10  10kΩ  [R0603]  79.02 40.59 90 top
R11  10kΩ  [R0603]  77.7 40.59 90 top
R12  1kΩ  [R0603]  91.49 49.58 90 top
R13  1kΩ  [R0603]  89.51 49.58 90 top
R14  10kΩ  [R0603]  90.07 72.32 90 top
R15  10kΩ  [R0603]  87.51 72.32 90 top
R16  47kΩ  [R0603]  86.21 49.56 270 top
R17  82kΩ  [R0603]  87.53 49.56 90 top
R19  100kΩ  [R0603]  94.06 24.49 90 top
R20  100Ω  [R0603]  13.97 5.72 90 top
R21  1kΩ  [R0603]  9.27 10.54 270 top
R22  0Ω  [R2512]  14.73 31.77 180 top
R23  10kΩ  [R0603]  21.34 26.27 180 top
R30  1kΩ  [R0603]  35.33 24.21 270 top
R33  1kΩ  [R0603]  33.89 26.98 90 top
R34  100kΩ  [R0603]  58.22 25 180 top
R35  22.1kΩ  [R0603]  58.22 23.65 180 top
R36  1kΩ  [R0603]  34.62 29.16 180 top
R37  1kΩ  [R0603]  44.55 73.66 90 top
R38  4.7kΩ  [R0603]  48.62 81.36 270 top
R39  1kΩ  [R0603]  46.46 78.03 270 top
SW1  SK12D07VG4  [SW-TH_SK12D07VG4]  97.81 25.23 90 top
TP6  -  [测试点]  6.58 1.78 0 top
TP7  -  [测试点]  11.51 87.79 0 top
TP8  -  [测试点]  11.5 70.71 0 top
TP9  -  [测试点]  18.21 24.35 0 top
TP10  -  [测试点]  11.94 22.88 0 top
TP11  -  [测试点]  32.88 32.9 0 top
TP12  -  [测试点]  58.59 28.74 0 top
TP13  -  [测试点]  23.05 37.82 0 top
TP14  -  [测试点]  13.95 17.17 0 top
U6  CH340K  [ESOP-10_L4.9-W3.9-P1.00-LS6.0-BL-EP]  78.36 36.27 90 top
U9  ETA9697E8A  [ESOP-8_L4.9-W3.9-P1.27-LS6.0-BL-EP]  39.44 26.36 0 top
U13  2.4GHz  [WIFIM-SMD_ESP-12F-ESP8266MOD]  83.86 60.94 180 top
U14  DW01A  [SOT-23-6_L2.9-W1.6-P0.95-LS2.8-BL]  9.27 4.96 180 top
U15  SM8082AAAC  [SOT-23-5_L3.0-W1.7-P0.95-LS2.8-BL]  54.41 24.23 180 top
U16  TXS0102DCUR  [VSON8_L2.0-W2.3-P0.50-LS3.1-BL]  48.01 74.15 90 top
USB1  TYPE-C 16PIN 2MD(073)  [USB-C-SMD_TYPE-C-6PIN-2MD-073]  95.03 41.63 90 top

## Footprints (pads in the part's own frame, mm; a bottom-side part is the same pattern mirrored in y, then rotated)
BATTERY-SMD_18650-1S-L77.1-W20.7-1
  rect 7.62x5.08 smd: 1(0,-41.313) 2(0,41.313)
C0603
  rect 0.8x0.9 smd: 1(-0.7,0) 2(0.7,0)
CAP-SMD_BD6.3-L6.6-W6.6-LS7.2-FD
  rect 3.5x1.2 smd: 1(-2.67,0) 2(2.67,0)
CONN-SMD_XUTS-2210-2261
  rect 0.8x1.6 smd: 1(-15.89,2.675) 2(-14.62,2.675) 3(-13.35,2.675) 4(-12.08,2.675) 5(-10.81,2.675) 6(-9.54,2.675) 7(-8.27,2.675) 8(-1.89,2.675) 9(-0.62,2.675) 10(0.65,2.675) 11(1.92,2.675) 12(3.19,2.675) 13(4.46,2.675) 14(5.73,2.675) 15(7,2.675) 16(8.27,2.675) 17(9.54,2.675) 18(10.81,2.675) 19(12.08,2.675) 20(13.35,2.675) 21(14.62,2.675) 22(15.89,2.675)
  rect 2.65x1.6 smd: 23(-24,-2.675)
  rect 2.65x2 smd: 24(24,-2.675)
CONN-TH_4P-P2.00_FWF20001-S04S22W5B
  round 1.7 hole 1.1: 1(-3,0) 2(-1,0) 3(1,0) 4(3,0)
ESOP-8_L4.9-W3.9-P1.27-LS6.0-BL-EP
  rect 0.6x1.2 smd: 1(-1.905,-2.909) 2(-0.635,-2.909) 3(0.635,-2.909) 4(1.905,-2.909) 5(1.905,2.909) 6(0.635,2.909) 7(-0.635,2.909) 8(-1.905,2.909)
  rect 3.3x2.4 smd: 9(0,0)
ESOP-10_L4.9-W3.9-P1.00-LS6.0-BL-EP
  rect 0.56x1.64 smd: 1(-2,-2.57) 2(-1,-2.57) 3(0,-2.57) 4(1,-2.57) 5(2,-2.57) 6(2,2.57) 7(1,2.57) 8(0,2.57) 9(-1,2.57) 10(-2,2.57)
  rect 3.3x2.1 smd: 11(0,0)
IND-SMD_L3.0-W3.0
  rect 1.5x3.32 smd: 1(1.328,0) 2(-1.328,0)
IND-SMD_L4.6-W4.1
  rect 1.5x1.7 smd: 1(-1.9,0) 2(1.9,0)
LED0603-RD_GREEN
  rect 0.8x0.8 smd: 1(-0.799,-0.004) 2(0.799,0.004)
R0603
  rect 0.806x0.864 smd: 1(-0.753,0) 2(0.753,0)
R2512
  rect 1.282x3.456 smd: 1(-3.067,0) 2(3.067,0)
RELAY-TH_SRD-03VDC-SL-C
  round 2.4 hole 1.6: 1(-5.1,-6) 2(7.1,-6) 3(7.1,6) 4(-5.1,6) 5(-7.1,0)
SMA_L4.3-W2.5-LS5.0-RD
  rect 2x1.593 smd: 1(-2.1,0) 2(2.1,0)
SMA_L4.4-W2.8-LS5.4-R-RD
  rect 2.062x1.539 smd: 1(2.503,0) 2(-2.503,0)
SOD-123FL_L2.7-W1.8-LS3.8-RD
  rect 1.4x1.2 smd: 1(-1.735,0) 2(1.735,0)
SOT-23-3_L2.9-W1.6-P1.90-LS2.8-BR
  rect 1.07x0.6 smd: 1(1.235,-0.95) 2(1.235,0.95) 3(-1.235,0)
SOT-23-5_L3.0-W1.7-P0.95-LS2.8-BL
  rect 0.49x1.157 smd: 1(-0.95,-1.153) 2(0,-1.153) 3(0.95,-1.153)
  rect 0.49x1.175 smd: 4(0.95,1.153) 5(-0.95,1.153)
SOT-23-6_L2.9-W1.6-P0.95-LS2.8-BL
  rect 0.532x1.072 smd: 1(-0.95,-1.149) 2(0,-1.149) 3(0.95,-1.149) 4(0.95,1.149) 5(0,1.149) 6(-0.95,1.149)
SW-TH_SK12D07VG4
  round 1.524 hole 0.914: 1(-2,0) 2(0,0) 3(2,0)
  oval 1.4x2.2 hole 0.8x1.6: 4(4.15,0) 5(-4.15,0)
TO-252-3_L6.5-W5.8-P4.58-TL
  rect 3x1.5 smd: 1(-3.457,2.26) 3(-3.457,-2.26)
  rect 6.5x5.8 smd: 2(3.457,0)
TSSOP-8_L4.4-W3.0-P0.65-LS6.4-BL
  oval 0.353x1.454 smd: 1(-0.975,-2.927) 2(-0.325,-2.927) 3(0.325,-2.927) 4(0.975,-2.927) 5(0.975,2.927) 6(0.325,2.927) 7(-0.325,2.927) 8(-0.975,2.927)
USB-C-SMD_TYPE-C-6PIN-2MD-073
  rect 0.55x1.1 smd: 1(-3.2,2.375) 2(-2.4,2.375) 11(2.4,2.375) 12(3.2,2.375)
  rect 0.3x1.1 smd: 3(-1.75,2.375) 4(-1.25,2.375) 5(-0.75,2.375) 6(-0.25,2.375) 7(0.25,2.375) 8(0.75,2.375) 9(1.25,2.375) 10(1.75,2.375)
  oval 1.1x2 hole 0.6x1.5: 13(-4.325,1.825) 14(4.325,1.825)
  oval 1.2x1.8 hole 0.6x1.2: 13(-4.325,-2.375) 14(4.325,-2.375)
VSON8_L2.0-W2.3-P0.50-LS3.1-BL
  rect 0.25x0.7 smd: 1(-0.762,-1.55) 2(-0.254,-1.55) 3(0.254,-1.55) 4(0.762,-1.55) 5(0.762,1.55) 6(0.254,1.55) 7(-0.254,1.55) 8(-0.762,1.55)
WIFIM-SMD_ESP-12F-ESP8266MOD
  rect 1.4x2.5 smd: 1(-7.651,-7.551) 2(-5.651,-7.551) 3(-3.651,-7.551) 4(-1.651,-7.551) 5(0.349,-7.551) 6(2.349,-7.551) 7(4.349,-7.551) 8(6.349,-7.551) 9(6.349,7.548) 10(4.349,7.55) 11(2.349,7.551) 12(0.349,7.551) 13(-1.651,7.55) 14(-3.651,7.551) 15(-5.651,7.551) 16(-7.651,7.551)
  rect 1.7x1.4 smd: 17(7.651,-5) 18(7.649,-3.002) 19(7.649,-1.004) 20(7.649,0.998) 21(7.649,2.997) 22(7.651,4.997)
测试点
  round 1.2 smd: 1(0,0)

## Nets
As in the schematic.

Pads without a net: CN2 1 2 3 4 5 6 7 8 9 10 18; CN3 4; CN4 4; U6 5; U13 2 4 5 6 7 11 17 18 19 20 21 22; U14 4; U16 1 8; USB1 2 3 4 9 10 11

## Via types
v1: diameter 0.61, hole 0.305, Top Layer to Bottom Layer, 231 vias

## Routing (per net, layer and track width the routed paths; a pad name or vN(x,y) marks a point on that pad's centre or on a via; arc(x,y) is an arc through that point)
3V3: length 113.9
  Top Layer w0.254: 90.03,73.07 R15.2 78.33,73.07 77.51,72.25 U13.8 ; 72.32,65.41 72.32,73.05 70.97,74.4 U16.3 48.29,74.4 48.03,74.15 48.03,73.31 47.64,72.91 R37.1
  Top Layer w0.3: U6.7 75.79,37.28 73.91,37.28 ; U6.10 73.91,34.27 73.41,34.77 73.41,36.78 73.91,37.28 ; 73.91,37.28 C2.2
  Top Layer w0.5: R34.1 58.97,28.35 TP12.1 ; C57.2 71.16,28.29 71.66,28.79 71.66,31.85 70.84,32.67 70.84,36.83 71.29,37.28 C2.2 72.32,65.41 73.54,66.63 C64.1 77.5,68.49 U13.8
+5V: length 178.5
  Top Layer w0.254: D4.1 42.69,77.15 43.13,76.71 43.13,74.07 43.54,73.66 45.52,73.66 45.75,73.89 U16.7
  Top Layer w0.5: v1(50.33,22.8) 50.33,20.9 51.13,20.09 94.39,20.09 95.51,21.21 95.51,22.81 95.92,23.23 SW1.1
  Top Layer w0.8: C59.2 50.32,24.6 v1(50.33,24.6) ; TP13.1 23.77,37.09 C61.2 ; v1(28.23,35.72) 23.81,35.72
  Top Layer w1: K2.4 39.37,73.2 41.05,74.88 41.05,77.05 ; K2.5 36.11,77.74 36.71,77.14 41.04,77.14
  Bottom Layer w1.5: K2.5 34.53,77.63 30.48,77.63 28.23,75.37 v1(28.23,36.76) v1(28.23,35.72) v1(28.23,34.68) 28.23,27.2 v1(28.2,27.17) v1(28.2,26.17)
  Bottom Layer w2.5: v1(28.2,26.17) v1(28.2,25.17) 28.2,19.63 30.28,17.55 48.62,17.55 50.33,19.26 v1(50.33,22.8) v1(50.33,23.7)
  vias: v1(27.2,27.17) v1(27.2,26.17) v1(27.2,25.17) v1(29.2,27.17) v1(29.2,26.17) v1(29.2,25.17) v1(49.43,24.6) v1(49.43,23.7) v1(49.43,22.8) v1(51.23,24.6) v1(51.23,23.7) v1(51.23,22.8)
GND:
  vias: v1(1.3,14.79) v1(1.63,1.98) v1(2.29,12.45) v1(2.29,10.16) v1(2.29,8.25) v1(5.34,12.45) v1(5.34,10.16) v1(6.78,3.76) v1(8.13,11.3) v1(8.97,21.19) v1(9.25,16.41) v1(9.83,91.24) v1(9.86,74.17) v1(10.14,36.85) v1(10.12,35.57) v1(10.14,34.29) v1(10.11,29.21) v1(10.11,26.66) v1(10.29,13.36) v1(11.58,3.81) v1(12.02,6.45) v1(14.43,37.25) v1(14.43,26.8) v1(14.73,31.77) v1(15.09,21.75) v1(16.31,6.45) v1(19.05,35.97) v1(19.46,26.27) v1(19.48,33.3) v1(19.61,15.14) v1(20.25,21.95) v1(22.35,34.67) v1(23.73,26.24) v1(23.8,32.28) v1(24.51,19.76) v1(25.17,9.55) v1(25.58,22.3) v1(26.32,12.98) v1(26.66,34.57) v1(26.75,36.93) v1(27.69,16.26) v1(30.3,30.89) v1(32.29,22.41) v1(32.39,28.5) v1(32.67,19.87) v1(32.92,12.98) v1(33.05,4.27) v1(35.94,83.52) v1(35.99,31.47) v1(36.61,29.16) v1(37.37,13.54) v1(38.27,26.4) v1(38.76,19.51) v1(39.44,26.36) v1(40.03,31.55) v1(40.46,72.55) v1(40.62,26.32) v1(41.05,79.25) v1(41.3,19.94) v1(42.29,75.44) v1(42.67,83.47) v1(43.11,29.75) v1(43.21,72.55) v1(43.49,11.33) v1(44.34,79.25) v1(44.67,23.14) v1(45.25,76.01) v1(46.45,83.07) v1(47.08,29.62) v1(47.47,81.56) v1(47.65,75.47) v1(48.22,79.25) v1(48.21,21.47) v1(48.59,72.11) v1(49.18,27.46) v1(49.84,15.78) v1(50.55,77.83) v1(51.21,29.62) v1(52.15,73.28) v1(52.1,7.39) v1(52.3,25.63) v1(52.35,18.95) v1(54.16,76.89) v1(54.08,24.32) v1(55.86,16.33) v1(56.34,26.01) v1(56.34,24.04) v1(57.61,22.51) v1(60.17,23.65) v1(60.33,26.8) v1(60.81,17.58) v1(61.24,30.38) v1(61.6,3.84) v1(63.12,73.36) v1(63.22,76.89) v1(64.9,24.36) v1(65.38,30.61) v1(66.73,18.49) v1(68.23,24.77) v1(69.67,34.57) v1(69.67,15.6) v1(70.59,31.04) v1(70.87,53.98) v1(70.87,45.14) v1(70.87,38.39) v1(71.1,71.58) v1(71.1,63.47) v1(71.17,27.05) v1(71.17,22.56) v1(71.45,12.42) v1(72.34,74.63) v1(72.65,76.89) v1(73.51,38.2) v1(73.94,46.56) v1(74.12,72.37) v1(74.3,40.95) v1(74.53,69.88) v1(74.53,32.36) v1(74.73,53.37) v1(74.73,43.92) v1(76.15,23.32) v1(76.53,71.28) v1(76.86,4.73) v1(76.96,73.99) v1(77.52,48.87) v1(77.85,66.5) v1(78.36,37.47) v1(78.36,36.27) v1(78.36,35.07) v1(78.46,56.09) v1(78.44,46.18) v1(78.64,71.99) v1(80.75,60.63) v1(80.72,51.31) v1(81.99,70.97) v1(82.37,48.52) v1(82.3,44.1) v1(82.53,27.87) v1(82.65,16.36) v1(82.91,40.13) v1(83.34,36.88) v1(84.36,46.54) v1(84.46,63.48) v1(84.41,55.6) v1(84.69,50.75) v1(85.07,66.25) v1(85.65,43.54) v1(85.76,71.52) v1(86.57,61.37) v1(86.57,55.87) v1(86.54,51.49) v1(87.05,36.78) v1(87.91,9.48) v1(88.37,48.8) v1(88.32,32.46) v1(88.45,51.44) v1(88.6,55.43) v1(88.6,45.21) v1(88.75,72.01) v1(88.85,62.39) v1(88.83,40.69) v1(90.48,70.41) v1(90.43,45.32) v1(90.53,51.39) v1(90.53,47.86) v1(91.51,73.86) v1(91.75,25.86) v1(91.9,56.59) v1(92.13,66.32) v1(92.31,51.39) v1(92.51,4.96) v1(95.25,38.89) v1(95.33,45.72) v1(95.51,33.81) v1(97.11,17.78) v1(97.08,1.32) v1(98.5,44.15) v1(98.58,39.45) v1(98.71,6.33)
VBAT: length 75.6
  Top Layer w0.254: R36.2 v1(33.87,30.51)
  Top Layer w0.5: TP14.1 13.95,11.7 BT1.2
  Top Layer w0.6: 40.08,22.45 41.01,21.52 46.41,21.52 47.29,22.4 L1.1 ; 40.08,22.45 40.08,23.45 ; 40.08,22.45 40.08,14.29 37.47,11.69 BT1.2
  Top Layer w0.8: BT1.2 13.97,11.65 R20.2
  Bottom Layer w0.254: v1(33.87,30.51) 33.87,22.27 35.77,20.37 v1(40.08,20.37)
VCC: length 133
  Top Layer w0.254: C51.2 33,23.44 32.69,23.75 32.69,27.48 32.95,27.73 R33.2
  Top Layer w0.5: 33.28,21.21 24.46,21.21 23.93,21.75 23.93,23.5 23.52,23.91 Q6.3 ; 33.28,21.21 33.91,21.84 C51.2 ; 33.28,21.21 38.05,21.21 38.81,21.97 U9.2 ; R16.2 v1(86.21,47.4)
  Top Layer w1.5: Q6.3 22.13,23.08 22.13,18.27 25.76,14.63 v1(34.83,14.63)
  Bottom Layer w0.5: v1(86.21,47.4) 86.21,46.36 84.84,44.99 73.97,44.99 72.27,43.28 72.27,16.74 70.16,14.63 v1(34.83,14.63)
  vias: v1(34.21,15.23) v1(34.23,14.01) v1(35.42,15.25) v1(35.44,14.04)
VCC_BK: length 27.4
  Top Layer w0.5: Q6.1 21.29,27.07 R23.1
  Top Layer w0.6: U9.5 41.35,32.17 40.61,32.9 C53.2 C54.2 28.52,32.9 27.89,33.53 21.92,33.53 21.3,32.91 D3.1
CTRL: length 51.4
  Top Layer w0.254: U13.13 85.51,63.75 v1(83.59,65.66) ; v1(50.62,75.44) 50.09,74.91 U16.4
  Bottom Layer w0.254: v1(50.62,75.44) 73.81,75.44 v1(83.59,65.66)
DET: length 4.4
  Top Layer w0.254: U13.14 87.51,50.34 R17.2 R16.1
DM: length 32.3
  Top Layer w0.32: v1(95.2,40.88) USB1.5 91.52,40.88 91.3,41.1 91.3,41.67 91.52,41.88 USB1.7 ; U6.2 v1(82.45,35.27)
  Bottom Layer w0.32: v1(95.2,40.88) 95.72,41.4 96.69,41.4 97.07,41.77 97.07,42.78 96.18,43.67 91.4,43.67 89.97,42.24 89.97,37.39 87.59,35.01 82.72,35.01 v1(82.45,35.27)
DP: length 32.3
  Top Layer w0.32: 93.79,42.38 94.01,42.17 94.01,41.6 93.79,41.38 USB1.6 ; 93.79,42.38 v1(95.18,42.38) ; 93.79,42.38 USB1.8 ; U6.1 v1(82.45,34.27)
  Bottom Layer w0.32: v1(95.18,42.38) 95.69,41.87 96.5,41.87 96.59,41.96 96.59,42.59 95.98,43.2 91.6,43.2 90.44,42.05 90.44,41.59 arc(90.58,41.25) 90.92,41.11 91.05,41.11 arc(91.53,40.63) 91.05,40.15 90.92,40.15 arc(90.44,39.67) 90.92,39.19 91.05,39.19 arc(91.53,38.71) 91.05,38.23 90.92,38.23 arc(90.58,38.09) 90.44,37.75 90.44,37.2 87.78,34.54 82.72,34.54 v1(82.45,34.27)
DSK_1: length 19.7
  Top Layer w1.5: 21.91,85.2 19.33,87.78 CN3.1
DSK_2: length 19.6
  Top Layer w1.5: CN4.1 19.4,70.69 21.91,73.2
DTR: length 15.6
  Top Layer w0.254: R10.1 v1(80.12,39.84) 81.5,39.84 82.26,39.08 82.26,37.53 82,37.27 U6.4 ; Q2.2 v1(76.89,43.01)
  Bottom Layer w0.254: v1(76.89,43.01) 77.67,43.79 80.22,43.79 80.88,43.13 80.88,40.59 v1(80.12,39.84)
EN: length 33.1
  Top Layer w0.254: Q3.3 86.66,45.48 v1(87.51,46.33) ; 87.51,66.12 U13.3 87.51,71.52
  Bottom Layer w0.254: v1(87.51,66.12) v1(87.51,46.33)
FB: length 3.7
  Top Layer w0.254: R34.2 R35.2 56.9,23.08 U15.5
IO0: length 13.7
  Top Layer w0.254: U13.12 83.51,48.2 82.58,47.27 77.32,47.27 76.84,46.79 Q2.3
OC: length 12.5
  Top Layer w0.254: Q4.5 3.26,9.34 3.61,9 5.89,9 ; 5.89,9 v1(7.37,9) ; 5.89,9 6.31,9.42 Q5.5 ; U14.3 v1(7.37,6.1)
  Bottom Layer w0.254: v1(7.37,9) v1(7.37,6.1)
OD: length 12.8
  Top Layer w0.254: U14.1 10.22,7.18 9.65,7.75 5.97,7.75 ; 6.31,5.45 6.31,7.41 5.97,7.75 ; 5.97,7.75 3.69,7.75 3.26,7.33 3.26,5.45
RST: length 4.5
  Top Layer w0.254: 90.07,71.57 C27.2 ; U13.1 91.51,71.52
RTS: length 9.9
  Top Layer w0.254: Q3.2 v1(79.96,43.01) ; R11.1 v1(76.66,39.84) 76.21,39.84 75.79,39.42 U6.6
  Bottom Layer w0.254: v1(79.96,43.01) 79.96,41 78.8,39.84 v1(76.66,39.84)
RXD: length 3.1
  Top Layer w0.254: R13.2 89.51,50.34 U13.15
STAT: length 4.7
  Top Layer w0.254: LED1.1 36.54,27.8 36.86,28.12 38.56,28.12 38.81,28.37 U9.7
TXD: length 3.1
  Top Layer w0.254: R12.2 91.51,50.35 U13.16
$2N350: length 3
  Top Layer w0.254: U13.10 79.51,50.39 R9.2
$3N377: length 1.7
  Top Layer w0.254: R10.2 79.02,42.95 Q3.1
$3N444: length 3.2
  Top Layer w0.254: Q2.1 75.89,41.85 76.39,41.35 R11.2
$3N643: length 27.2
  Top Layer w0.254: R12.1 v1(91.49,47.65) ; U6.9 v1(74.32,35.27)
  Bottom Layer w0.254: v1(91.49,47.65) 91.49,45.14 84.43,38.08 77.4,38.08 76.89,37.57 76.89,36.25 75.91,35.27 v1(74.32,35.27)
$3N646: length 25
  Top Layer w0.254: R13.1 v1(89.51,47.65) ; U6.8 v1(74.32,36.27)
  Bottom Layer w0.254: v1(74.32,36.27) 75.31,36.27 75.92,36.88 75.92,38.08 76.84,38.99 83.9,38.99 89.51,44.61 v1(89.51,47.65)
$4N1324: length 103
  Top Layer w0.5: U14.6 10.22,1.78
  Top Layer w2: BT1.1 96.56,5.15 93.19,1.78 TP6.1 4.45,1.78 3.81,2.42
$4N1325: length 5.6
  Top Layer w0.254: R20.1 9.66,4.96 9.27,4.57 U14.5
$4N1333: length 9.2
  Top Layer w0.254: v1(7.37,4.96) 8.77,4.96 9.27,5.46 U14.2 ; R21.2 v1(9.27,8.64)
  Bottom Layer w0.254: v1(9.27,8.64) 9.27,5.46 8.77,4.96 v1(7.37,4.96)
$4N1334: length 14.8
  Top Layer w0.254: Q4.8 v1(1.31,6.99) 1.31,5.45 ; 4.36,5.45 v1(4.36,6.99) ; Q5.8 v1(4.36,9.77)
  Bottom Layer w0.254: v1(4.36,9.77) v1(4.36,6.99) v1(1.31,6.99)
$4N1454: length 5.8
  Top Layer w0.8: TP10.1 11.94,22.87 CN2.22 CN2.21 CN2.20
$4N2608: length 2.2
  Top Layer w0.254: U9.1 37.53,23.46 35.33,23.46
$4N2625: length 1.4
  Top Layer w0.254: LED1.2 35.24,26.22 R33.1
$4N3320: length 44.8
  Top Layer w0.254: 55.36,25.39 55.36,24.57 54.46,23.68 54.46,22.33 55.12,21.67 93.04,21.67 94.06,22.68 R19.1
$4N3323: length 3.2
  Top Layer w0.5: 53.46,25.39 53.47,25.39 L3.2
$4N3333: length 3.8
  Top Layer w0.5: R19.2 97.79,25.24 SW1.2
$4N3483: length 6.7
  Top Layer w0.254: 40.08,29.27 40.08,30.15 39.82,30.41 35.74,30.41 35.38,30.04 R36.1
$4N3698: length 1.9
  Top Layer w0.254: R37.2 44.57,74.4 U16.6
$4N3891: length 3.9
  Top Layer w0.254: R38.2 48.42,80.41 Q7.1 46.46,80.4 R39.1
$4N3897: length 2.4
  Top Layer w0.254: R39.2 46.46,74.91
$4N4001: length 12.7
  Top Layer w1: K2.1 39.37,85.2 41.05,83.52 D4.2 41.06,81.36 43.98,81.36
$4N6210: length 4.7
  Top Layer w0.5: L1.2 43.49,24.14 42.81,23.45 U9.4

## Copper pours and planes (outline as drawn; the poured copper is in the pictures)
3V3 on Top Layer: 55.32,31.5 70.61,31.5 70.61,26.85 55.32,26.85
+5V on Top Layer: 24.89,32.62 31.52,32.62 31.52,23.22 24.89,23.22
+5V on Top Layer: 49.08,24.95 51.58,24.95 51.58,22.45 49.08,22.45
+5V on Top Layer: 51.58,23.73 53.76,23.73 53.76,22.45 51.58,22.45
+5V on Bottom Layer: 49.08,24.95 51.58,24.95 51.58,22.45 49.08,22.45
+5V on Bottom Layer: 26.7,27.67 29.7,27.67 29.7,24.67 26.7,24.67
GND on Top Layer: 0,100 100,100 100,0 0,0
GND on Bottom Layer: 0,100 100,100 100,0 0,0
VCC on Top Layer: 33.83,15.63 35.83,15.63 35.83,13.63 33.83,13.63
VCC on Top Layer: 17.1,33.56 22.86,33.56 22.86,23.09 17.1,23.09
VCC on Bottom Layer: 33.83,15.63 35.83,15.63 35.83,13.63 33.83,13.63
VCC_BK on Top Layer: 19.74,32.62 22.84,32.62 22.84,27.61 19.74,27.61
$4N468 on Top Layer: 7.77,33.49 12.32,33.49 12.32,30.04 7.77,30.04
$4N1324 on Top Layer: 1.78,6.23 5.84,6.23 5.84,3.69 1.78,3.69
$4N1324 on Top Layer: 2.81,3.69 4.83,3.69 4.83,2.42 2.81,2.42

## Text on the board
Top Silkscreen Layer: ON | OFF | SATA | Disk1 | Disk2
